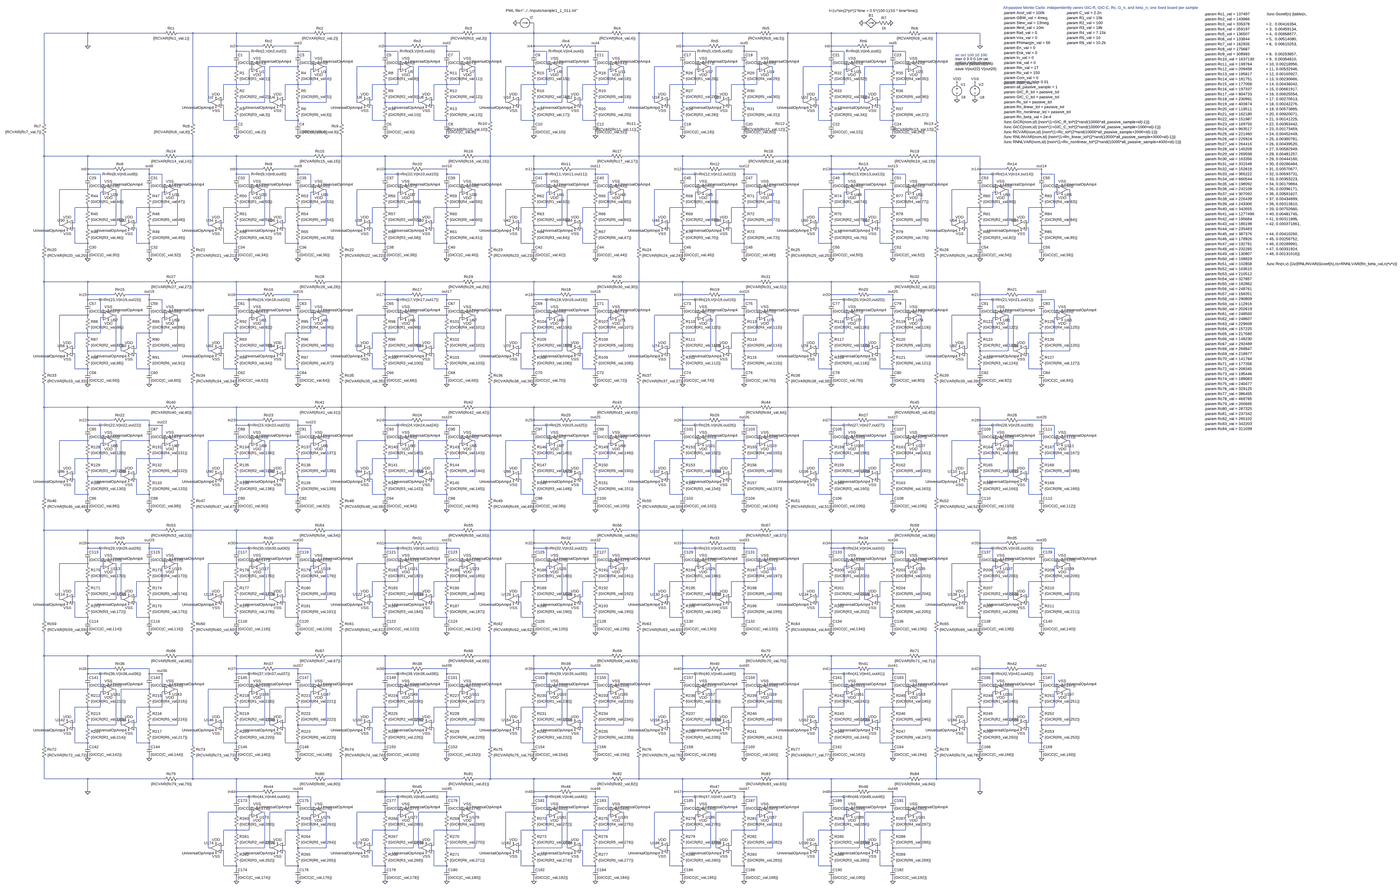
[diagram p0: schematic ALL.asc, whole sheet]
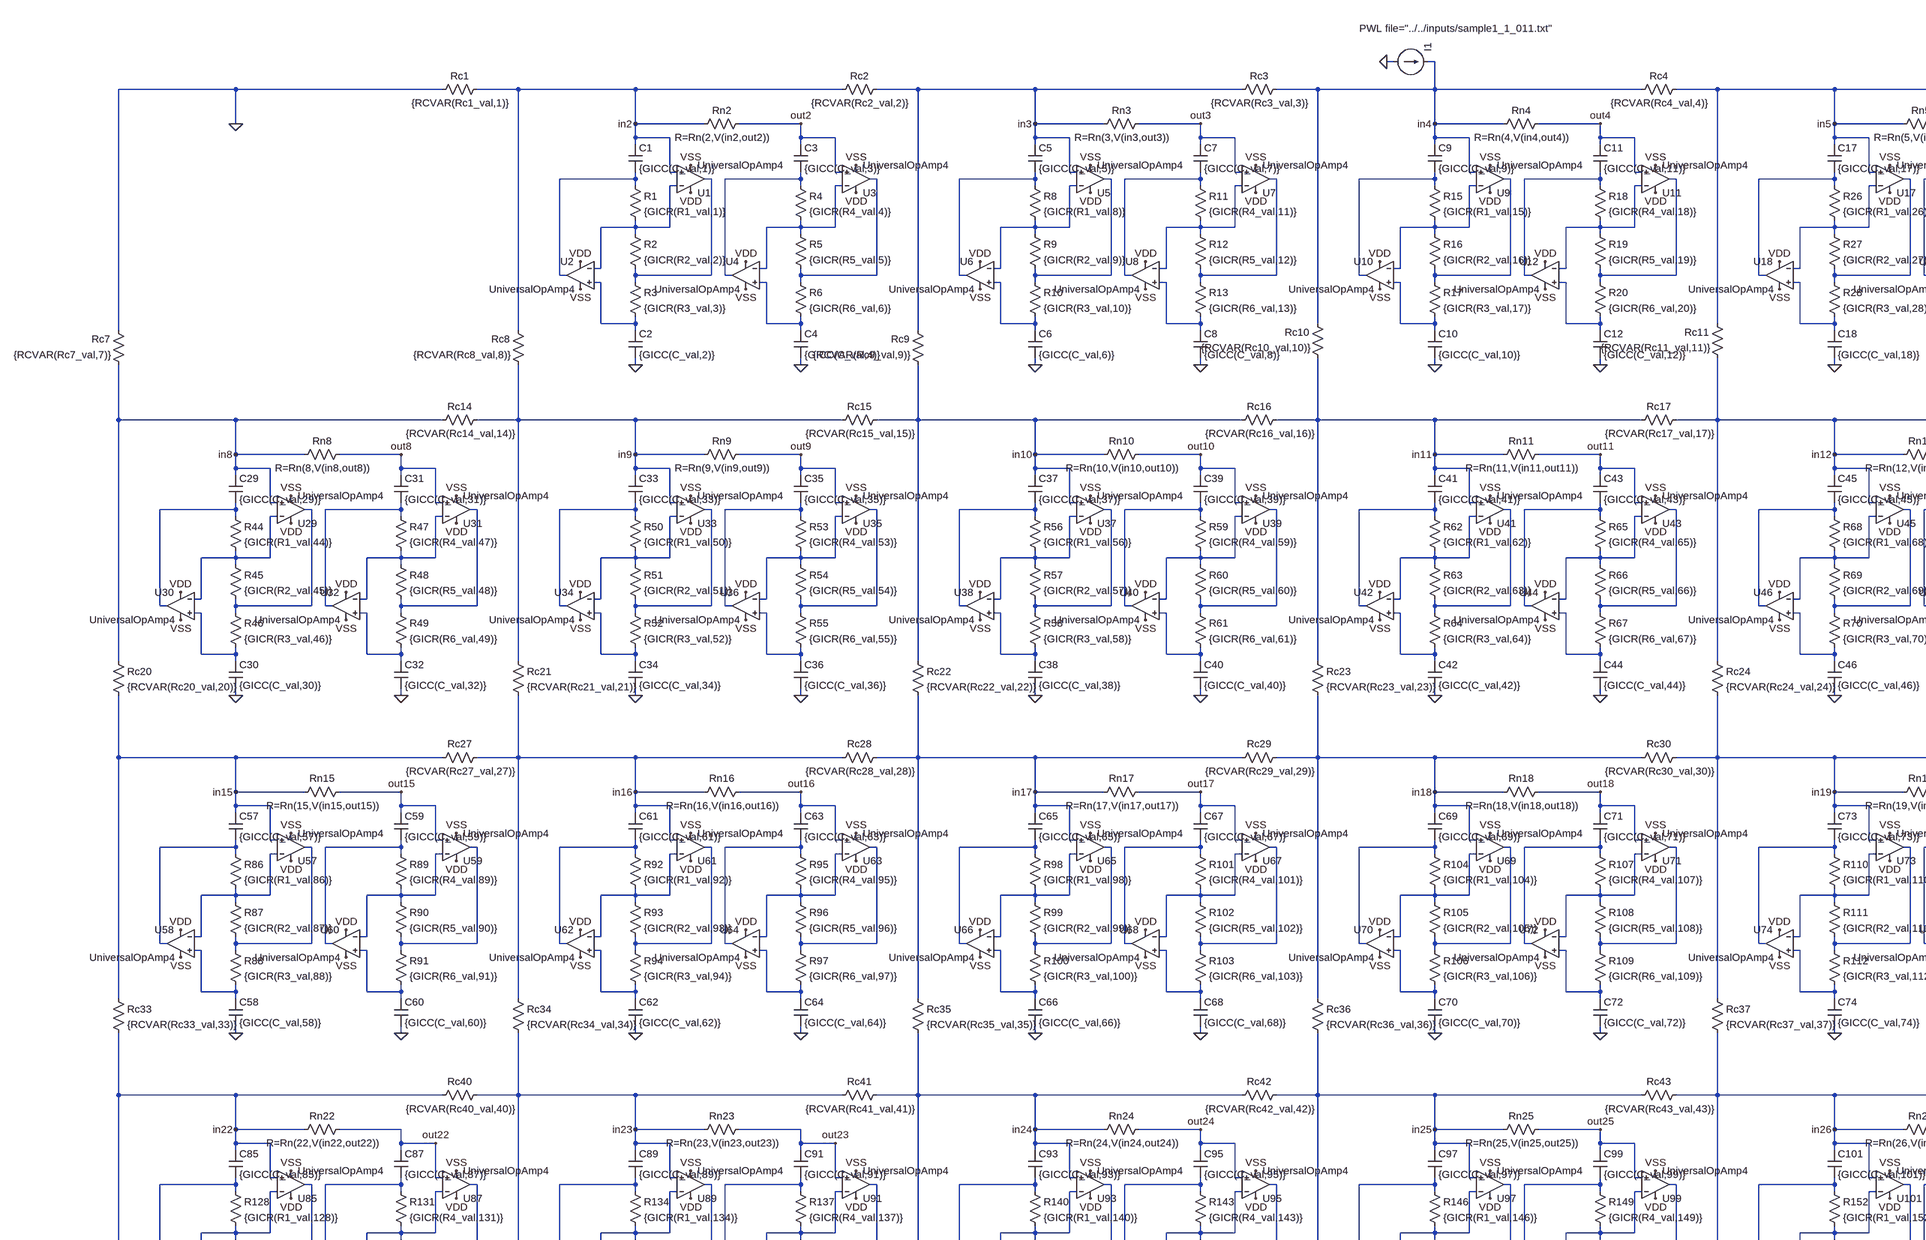
[diagram p1: schematic ALL.asc, part, row 1 of 2, column 1 of 2]
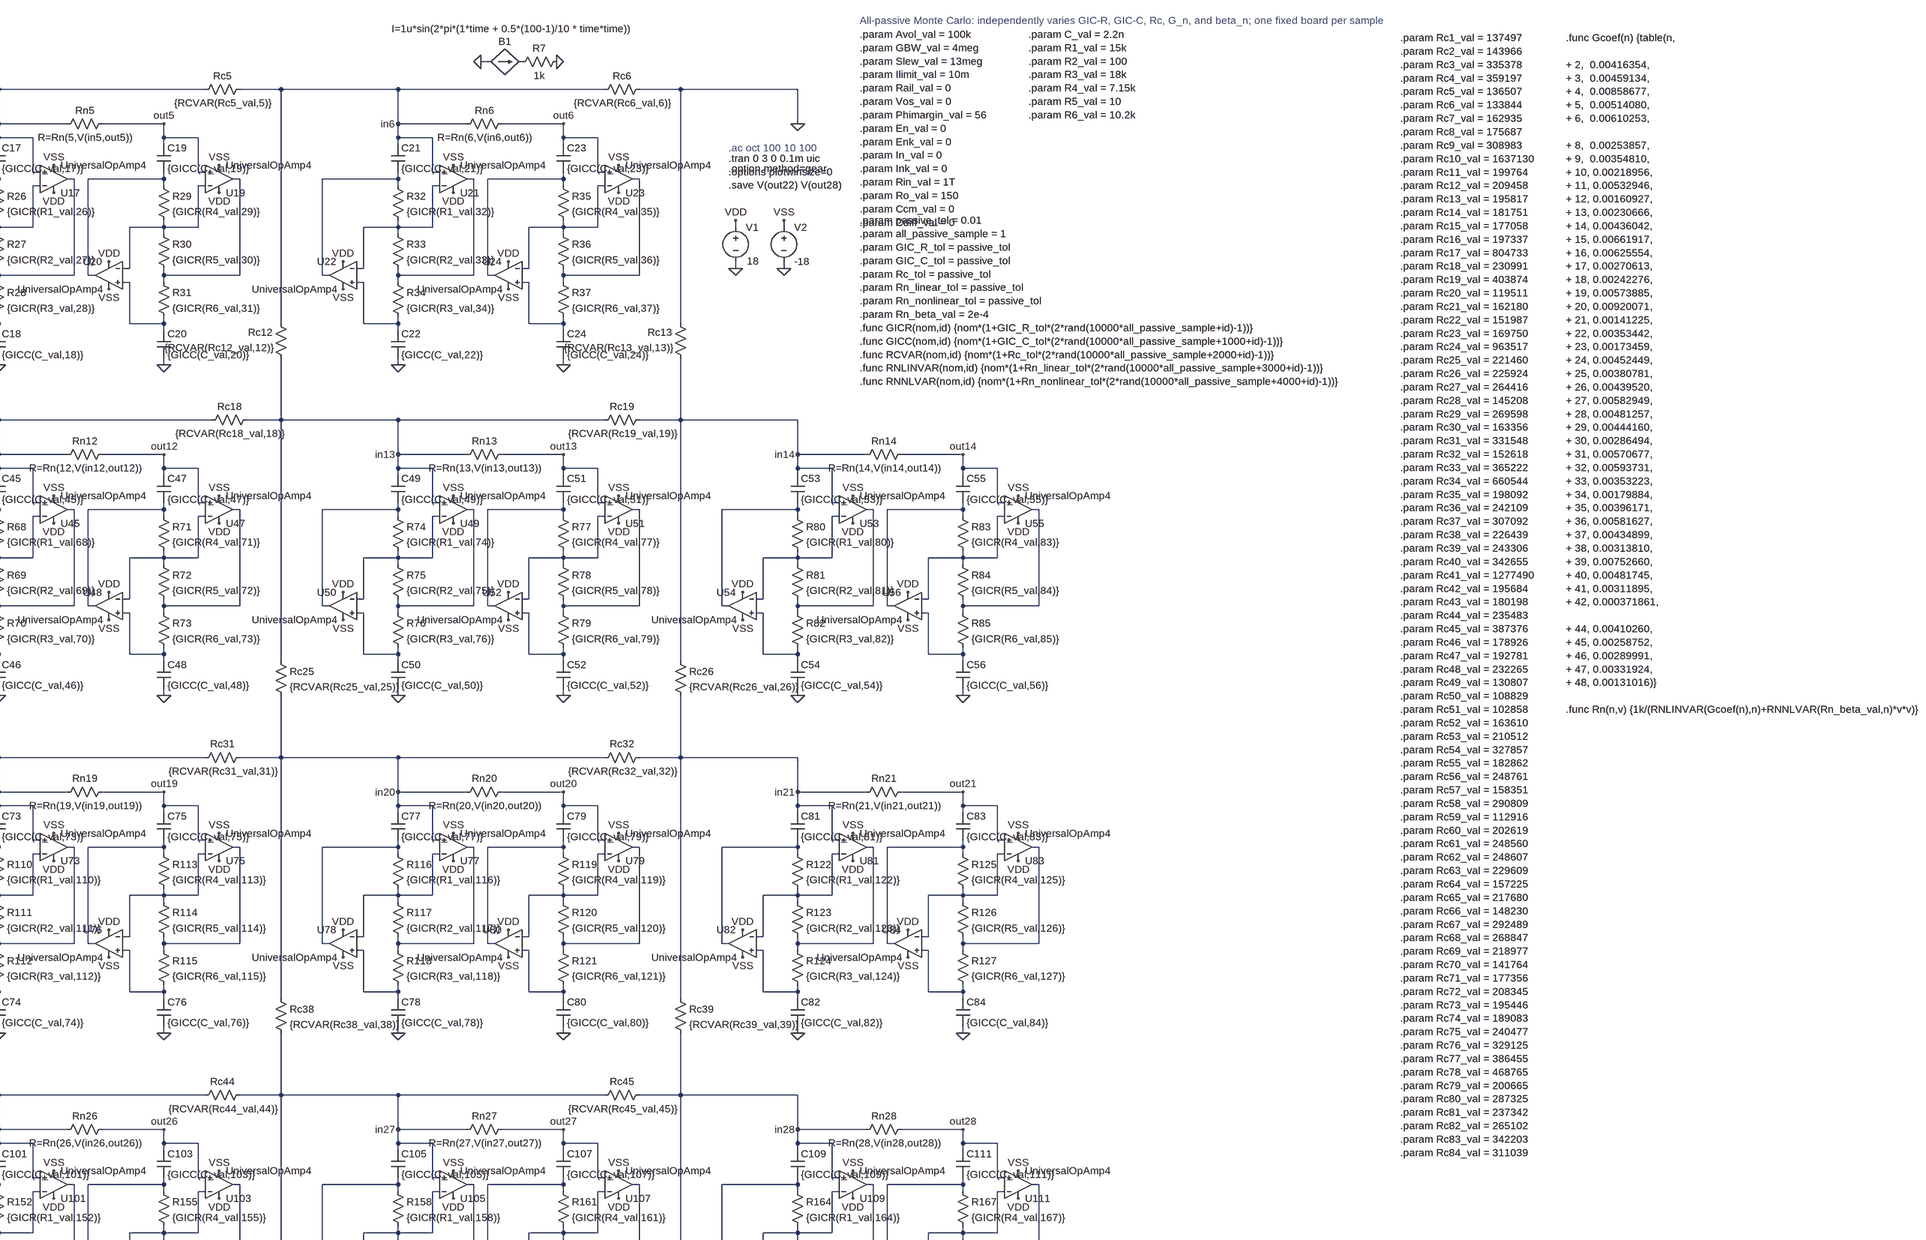
[diagram p2: schematic ALL.asc, part, row 1 of 2, column 2 of 2]
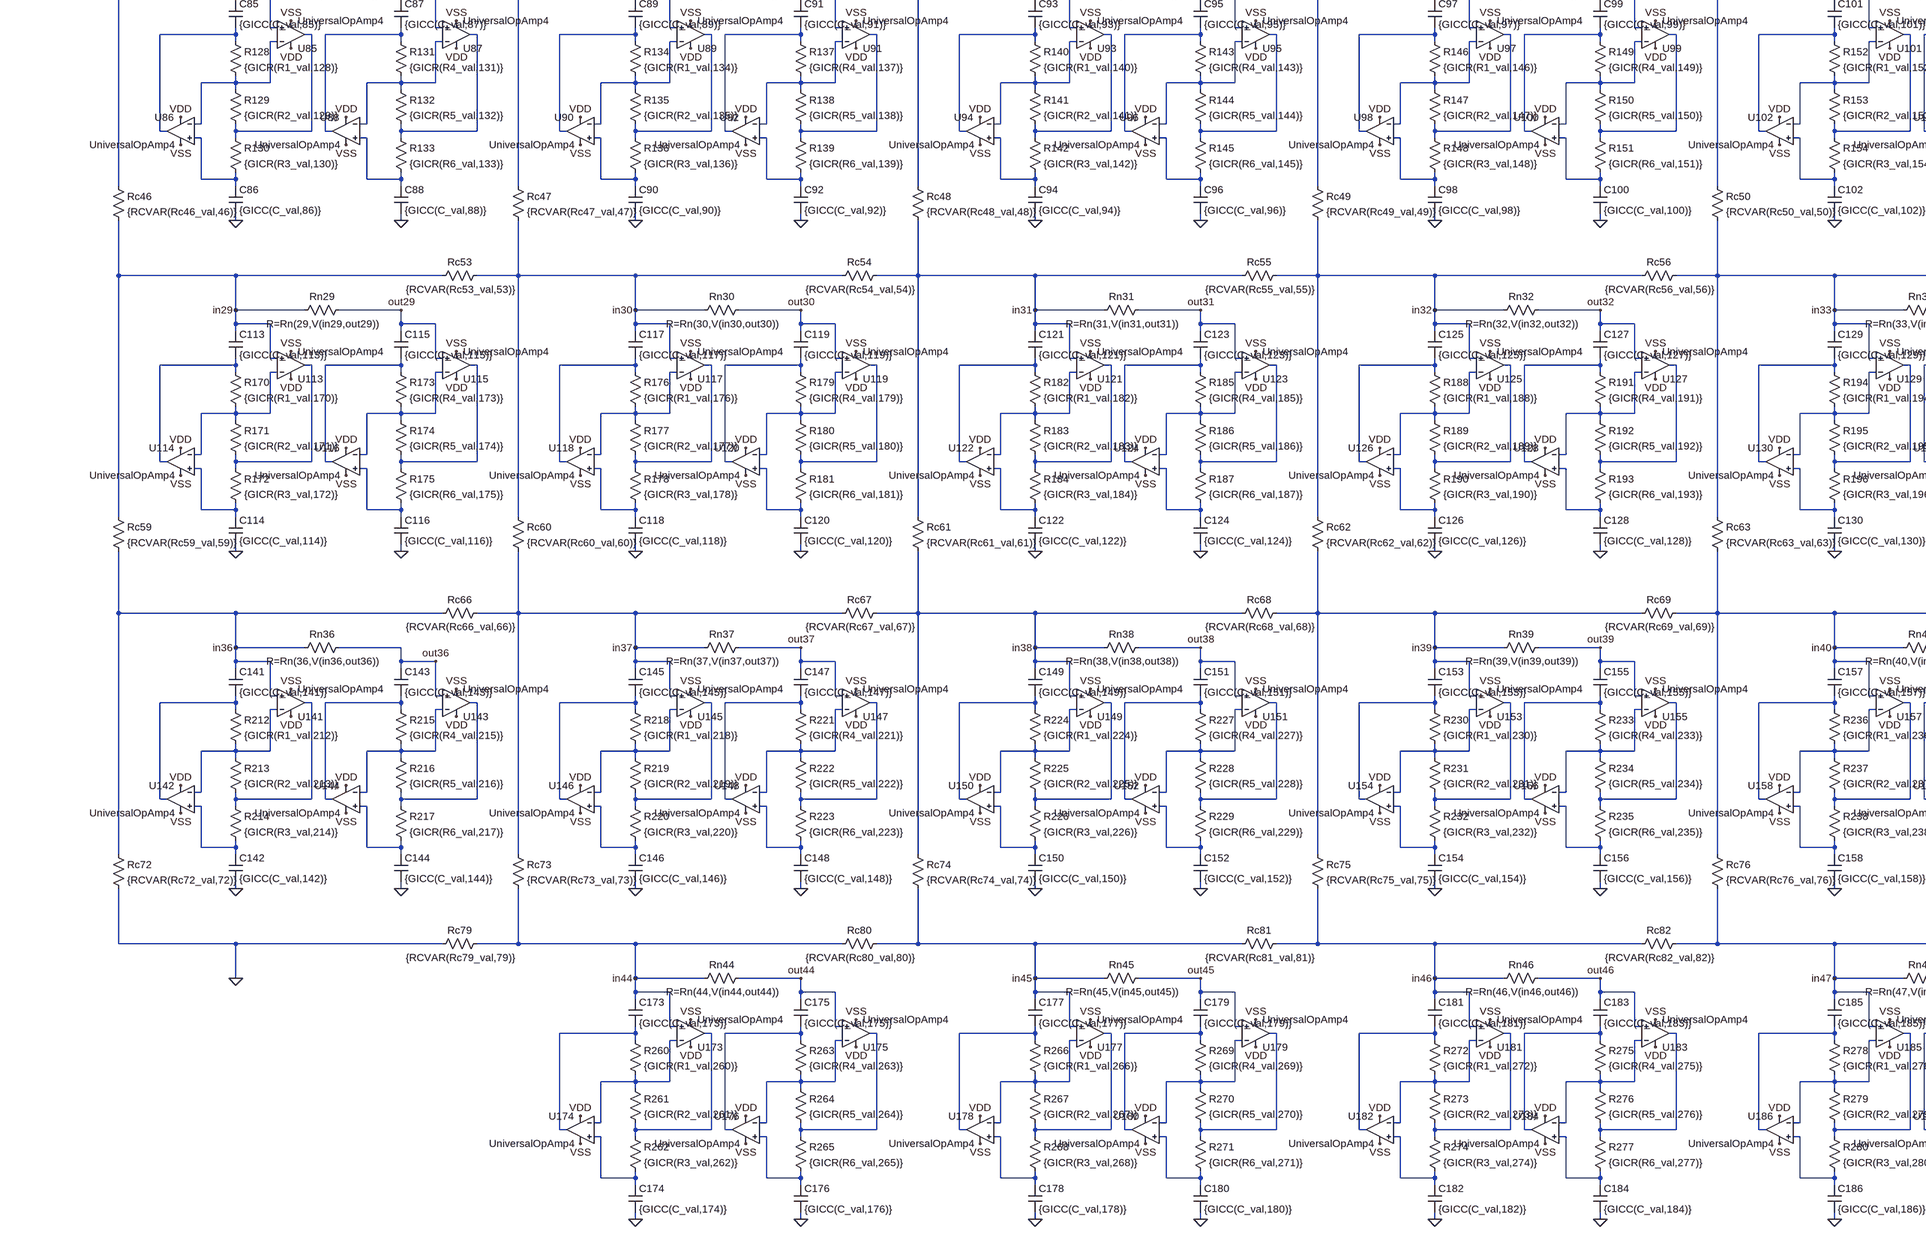
[diagram p3: schematic ALL.asc, part, row 2 of 2, column 1 of 2]
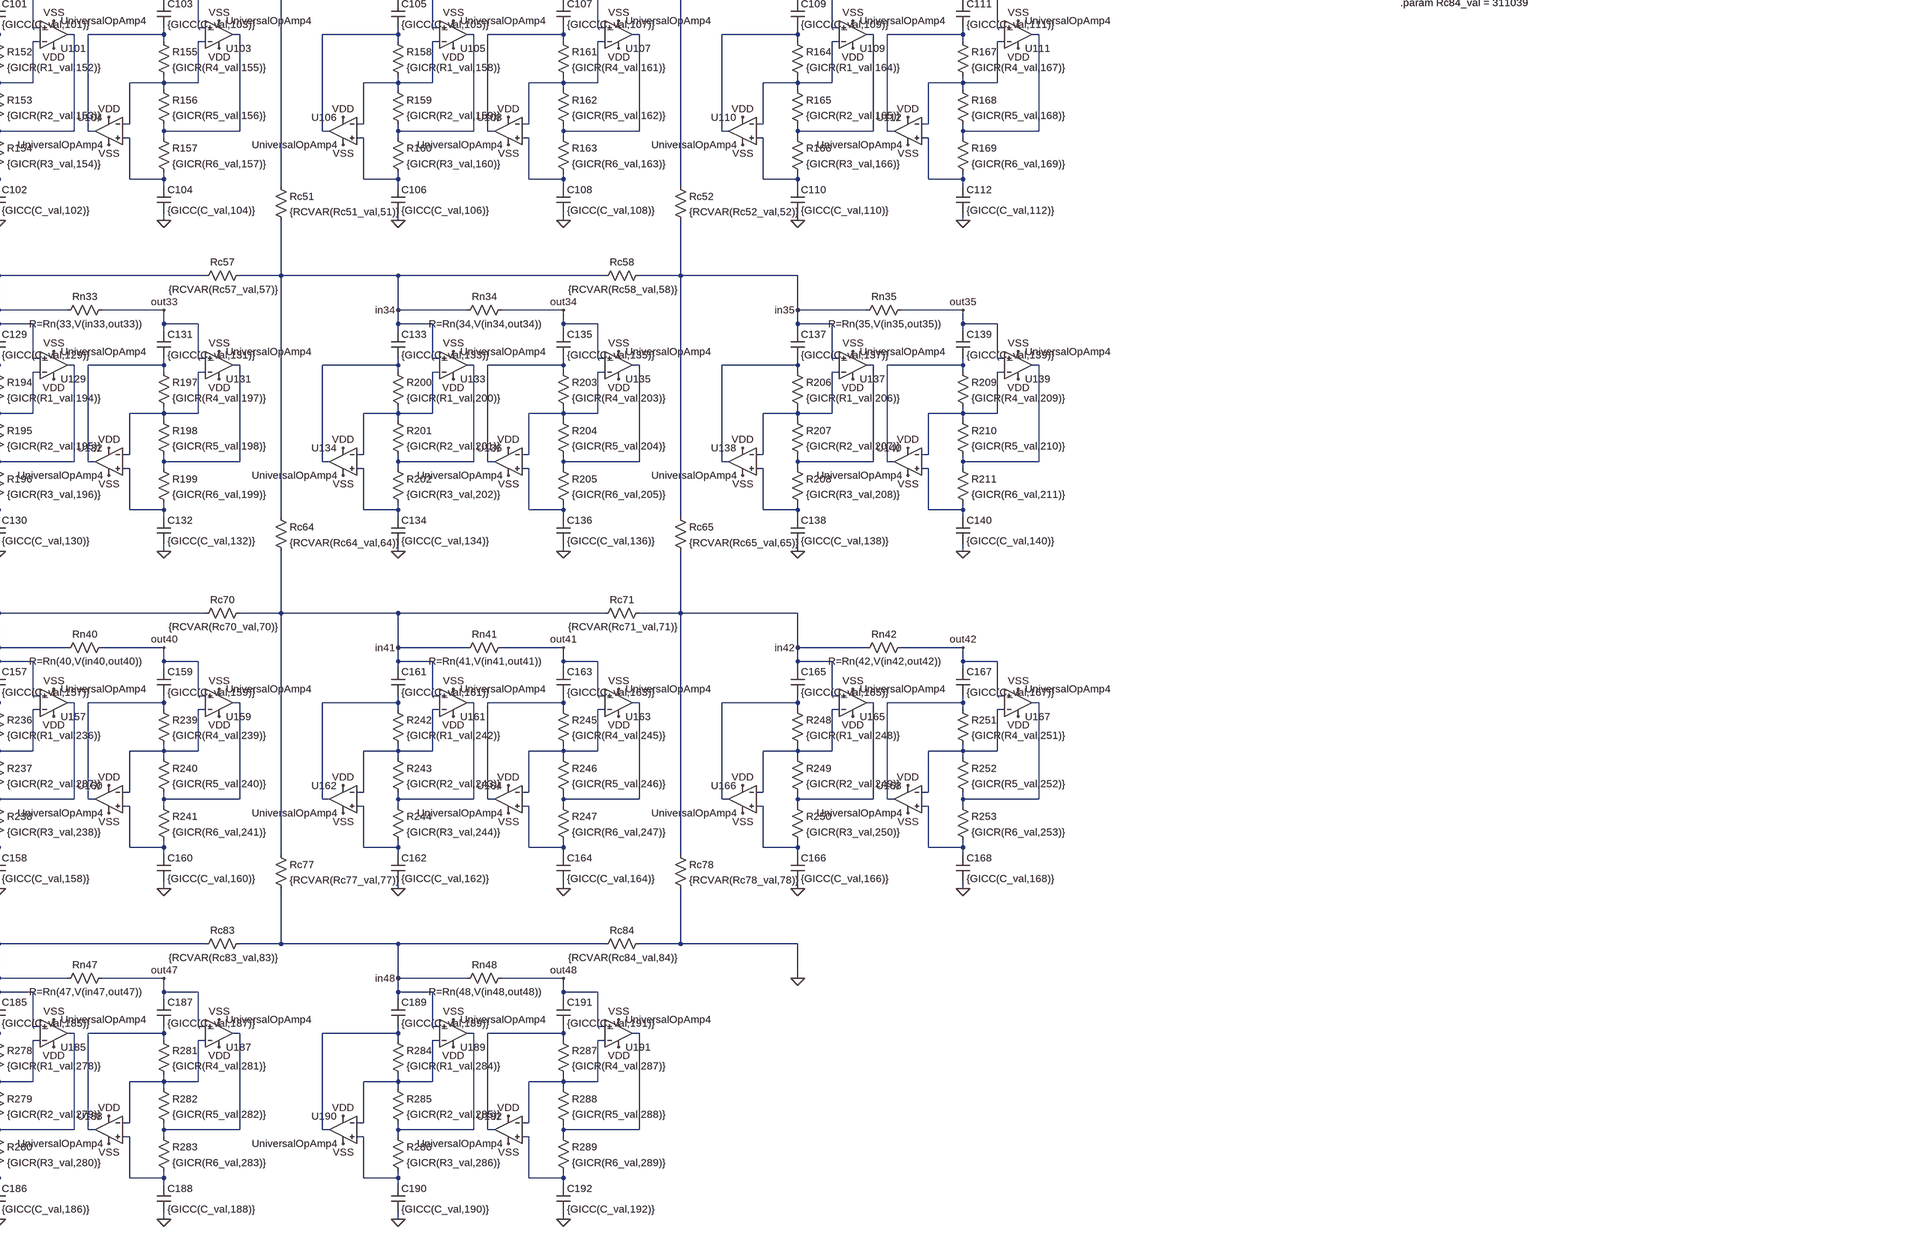
[diagram p4: schematic ALL.asc, part, row 2 of 2, column 2 of 2]
* ALL.asc
V1 VDD 0 18
V2 VSS 0 -18
C1 in2 N001 {GICC(C_val,1)}
R1 N001 N021 {GICR(R1_val,1)}
R2 N021 N002 {GICR(R2_val,2)}
R3 N002 N031 {GICR(R3_val,3)}
C2 N031 0 {GICC(C_val,2)}
C3 out2 N003 {GICC(C_val,3)}
R4 N003 N022 {GICR(R4_val,4)}
R5 N022 N004 {GICR(R5_val,5)}
R6 N004 N032 {GICR(R6_val,6)}
C4 N032 0 {GICC(C_val,4)}
Rn2 out2 in2 R=Rn(2,V(in2,out2))
C5 in3 N005 {GICC(C_val,5)}
R8 N005 N023 {GICR(R1_val,8)}
R9 N023 N006 {GICR(R2_val,9)}
R10 N006 N033 {GICR(R3_val,10)}
C6 N033 0 {GICC(C_val,6)}
C7 out3 N007 {GICC(C_val,7)}
R11 N007 N024 {GICR(R4_val,11)}
R12 N024 N008 {GICR(R5_val,12)}
R13 N008 N034 {GICR(R6_val,13)}
C8 N034 0 {GICC(C_val,8)}
Rn3 out3 in3 R=Rn(3,V(in3,out3))
C9 in4 N009 {GICC(C_val,9)}
R15 N009 N025 {GICR(R1_val,15)}
R16 N025 N010 {GICR(R2_val,16)}
R17 N010 N035 {GICR(R3_val,17)}
C10 N035 0 {GICC(C_val,10)}
C11 out4 N011 {GICC(C_val,11)}
R18 N011 N026 {GICR(R4_val,18)}
R19 N026 N012 {GICR(R5_val,19)}
R20 N012 N036 {GICR(R6_val,20)}
C12 N036 0 {GICC(C_val,12)}
Rn4 out4 in4 R=Rn(4,V(in4,out4))
Rc2 in3 in2 {RCVAR(Rc2_val,2)}
Rc3 in4 in3 {RCVAR(Rc3_val,3)}
Rc8 in9 in2 {RCVAR(Rc8_val,8)}
Rc9 in10 in3 {RCVAR(Rc9_val,9)}
Rc10 in11 in4 {RCVAR(Rc10_val,10)}
Rc14 in8 in9 {RCVAR(Rc14_val,14)}
Rc15 in9 in10 {RCVAR(Rc15_val,15)}
Rc16 in10 in11 {RCVAR(Rc16_val,16)}
Rc17 in11 in12 {RCVAR(Rc17_val,17)}
Rc20 in8 in15 {RCVAR(Rc20_val,20)}
Rc21 in9 in16 {RCVAR(Rc21_val,21)}
Rc22 in10 in17 {RCVAR(Rc22_val,22)}
Rc23 in11 in18 {RCVAR(Rc23_val,23)}
Rc24 in12 in19 {RCVAR(Rc24_val,24)}
Rc27 in16 in15 {RCVAR(Rc27_val,27)}
Rc28 in17 in16 {RCVAR(Rc28_val,28)}
Rc29 in18 in17 {RCVAR(Rc29_val,29)}
Rc30 in19 in18 {RCVAR(Rc30_val,30)}
Rc33 in15 in22 {RCVAR(Rc33_val,33)}
Rc34 in16 in23 {RCVAR(Rc34_val,34)}
Rc35 in17 in24 {RCVAR(Rc35_val,35)}
Rc36 in18 in25 {RCVAR(Rc36_val,36)}
Rc37 in19 in26 {RCVAR(Rc37_val,37)}
Rc40 in23 in22 {RCVAR(Rc40_val,40)}
Rc41 in24 in23 {RCVAR(Rc41_val,41)}
Rc42 in25 in24 {RCVAR(Rc42_val,42)}
Rc43 in26 in25 {RCVAR(Rc43_val,43)}
Rc46 in22 in29 {RCVAR(Rc46_val,46)}
Rc47 in23 in30 {RCVAR(Rc47_val,47)}
Rc48 in24 in31 {RCVAR(Rc48_val,48)}
Rc49 in25 in32 {RCVAR(Rc49_val,49)}
Rc50 in26 in33 {RCVAR(Rc50_val,50)}
Rc1 in2 0 {RCVAR(Rc1_val,1)}
Rc7 in8 0 {RCVAR(Rc7_val,7)}
Rc11 in12 in5 {RCVAR(Rc11_val,11)}
Rc4 in4 in5 {RCVAR(Rc4_val,4)}
Rc53 in30 in29 {RCVAR(Rc53_val,53)}
Rc54 in31 in30 {RCVAR(Rc54_val,54)}
Rc55 in32 in31 {RCVAR(Rc55_val,55)}
Rc56 in33 in32 {RCVAR(Rc56_val,56)}
R7 0 P001 1k
B1 0 P001 I=1u*sin(2*pi*(1*time + 0.5*(100-1)/10 * time*time))
I1 0 in4 PWL file="../../inputs/sample1_1_011.txt"
* U1: UniversalOpAmp4 Avol={Avol_val} GBW={GBW_val} Slew={Slew_val} Ilimit={Ilimit_val} Rail={Rail_val} Vos={Vos_val} Phimargin={Phimargin_val} En={En_val} Enk={Enk_val} In={In_val} Ink={Ink_val} Rin={Rin_val} Ro={Ro_val} Ccm={Ccm_val} Cdiff={Cdiff_val} (symbol OpAmps\UniversalOpAmp4 not available, pins judged from their places): In+=in2 In-=N021 V+=VDD V-=VSS OUT=N002
* U2: UniversalOpAmp4 Avol={Avol_val} GBW={GBW_val} Slew={Slew_val} Ilimit={Ilimit_val} Rail={Rail_val} Vos={Vos_val} Phimargin={Phimargin_val} En={En_val} Enk={Enk_val} In={In_val} Ink={Ink_val} Rin={Rin_val} Ro={Ro_val} Ccm={Ccm_val} Cdiff={Cdiff_val} (symbol OpAmps\UniversalOpAmp4 not available, pins judged from their places): In+=N031 In-=N021 V+=VDD V-=VSS OUT=N001
* U3: UniversalOpAmp4 Avol={Avol_val} GBW={GBW_val} Slew={Slew_val} Ilimit={Ilimit_val} Rail={Rail_val} Vos={Vos_val} Phimargin={Phimargin_val} En={En_val} Enk={Enk_val} In={In_val} Ink={Ink_val} Rin={Rin_val} Ro={Ro_val} Ccm={Ccm_val} Cdiff={Cdiff_val} (symbol OpAmps\UniversalOpAmp4 not available, pins judged from their places): In+=out2 In-=N022 V+=VDD V-=VSS OUT=N004
* U4: UniversalOpAmp4 Avol={Avol_val} GBW={GBW_val} Slew={Slew_val} Ilimit={Ilimit_val} Rail={Rail_val} Vos={Vos_val} Phimargin={Phimargin_val} En={En_val} Enk={Enk_val} In={In_val} Ink={Ink_val} Rin={Rin_val} Ro={Ro_val} Ccm={Ccm_val} Cdiff={Cdiff_val} (symbol OpAmps\UniversalOpAmp4 not available, pins judged from their places): In+=N032 In-=N022 V+=VDD V-=VSS OUT=N003
* U5: UniversalOpAmp4 Avol={Avol_val} GBW={GBW_val} Slew={Slew_val} Ilimit={Ilimit_val} Rail={Rail_val} Vos={Vos_val} Phimargin={Phimargin_val} En={En_val} Enk={Enk_val} In={In_val} Ink={Ink_val} Rin={Rin_val} Ro={Ro_val} Ccm={Ccm_val} Cdiff={Cdiff_val} (symbol OpAmps\UniversalOpAmp4 not available, pins judged from their places): In+=in3 In-=N023 V+=VDD V-=VSS OUT=N006
* U6: UniversalOpAmp4 Avol={Avol_val} GBW={GBW_val} Slew={Slew_val} Ilimit={Ilimit_val} Rail={Rail_val} Vos={Vos_val} Phimargin={Phimargin_val} En={En_val} Enk={Enk_val} In={In_val} Ink={Ink_val} Rin={Rin_val} Ro={Ro_val} Ccm={Ccm_val} Cdiff={Cdiff_val} (symbol OpAmps\UniversalOpAmp4 not available, pins judged from their places): In+=N033 In-=N023 V+=VDD V-=VSS OUT=N005
* U7: UniversalOpAmp4 Avol={Avol_val} GBW={GBW_val} Slew={Slew_val} Ilimit={Ilimit_val} Rail={Rail_val} Vos={Vos_val} Phimargin={Phimargin_val} En={En_val} Enk={Enk_val} In={In_val} Ink={Ink_val} Rin={Rin_val} Ro={Ro_val} Ccm={Ccm_val} Cdiff={Cdiff_val} (symbol OpAmps\UniversalOpAmp4 not available, pins judged from their places): In+=out3 In-=N024 V+=VDD V-=VSS OUT=N008
* U8: UniversalOpAmp4 Avol={Avol_val} GBW={GBW_val} Slew={Slew_val} Ilimit={Ilimit_val} Rail={Rail_val} Vos={Vos_val} Phimargin={Phimargin_val} En={En_val} Enk={Enk_val} In={In_val} Ink={Ink_val} Rin={Rin_val} Ro={Ro_val} Ccm={Ccm_val} Cdiff={Cdiff_val} (symbol OpAmps\UniversalOpAmp4 not available, pins judged from their places): In+=N034 In-=N024 V+=VDD V-=VSS OUT=N007
* U9: UniversalOpAmp4 Avol={Avol_val} GBW={GBW_val} Slew={Slew_val} Ilimit={Ilimit_val} Rail={Rail_val} Vos={Vos_val} Phimargin={Phimargin_val} En={En_val} Enk={Enk_val} In={In_val} Ink={Ink_val} Rin={Rin_val} Ro={Ro_val} Ccm={Ccm_val} Cdiff={Cdiff_val} (symbol OpAmps\UniversalOpAmp4 not available, pins judged from their places): In+=in4 In-=N025 V+=VDD V-=VSS OUT=N010
* U10: UniversalOpAmp4 Avol={Avol_val} GBW={GBW_val} Slew={Slew_val} Ilimit={Ilimit_val} Rail={Rail_val} Vos={Vos_val} Phimargin={Phimargin_val} En={En_val} Enk={Enk_val} In={In_val} Ink={Ink_val} Rin={Rin_val} Ro={Ro_val} Ccm={Ccm_val} Cdiff={Cdiff_val} (symbol OpAmps\UniversalOpAmp4 not available, pins judged from their places): In+=N035 In-=N025 V+=VDD V-=VSS OUT=N009
* U11: UniversalOpAmp4 Avol={Avol_val} GBW={GBW_val} Slew={Slew_val} Ilimit={Ilimit_val} Rail={Rail_val} Vos={Vos_val} Phimargin={Phimargin_val} En={En_val} Enk={Enk_val} In={In_val} Ink={Ink_val} Rin={Rin_val} Ro={Ro_val} Ccm={Ccm_val} Cdiff={Cdiff_val} (symbol OpAmps\UniversalOpAmp4 not available, pins judged from their places): In+=out4 In-=N026 V+=VDD V-=VSS OUT=N012
* U12: UniversalOpAmp4 Avol={Avol_val} GBW={GBW_val} Slew={Slew_val} Ilimit={Ilimit_val} Rail={Rail_val} Vos={Vos_val} Phimargin={Phimargin_val} En={En_val} Enk={Enk_val} In={In_val} Ink={Ink_val} Rin={Rin_val} Ro={Ro_val} Ccm={Ccm_val} Cdiff={Cdiff_val} (symbol OpAmps\UniversalOpAmp4 not available, pins judged from their places): In+=N036 In-=N026 V+=VDD V-=VSS OUT=N011
Rc12 in13 in6 {RCVAR(Rc12_val,12)}
Rc19 in13 in14 {RCVAR(Rc19_val,19)}
Rc25 in13 in20 {RCVAR(Rc25_val,25)}
Rc26 in14 in21 {RCVAR(Rc26_val,26)}
Rc32 in21 in20 {RCVAR(Rc32_val,32)}
Rc38 in20 in27 {RCVAR(Rc38_val,38)}
Rc39 in21 in28 {RCVAR(Rc39_val,39)}
Rc45 in28 in27 {RCVAR(Rc45_val,45)}
Rc51 in27 in34 {RCVAR(Rc51_val,51)}
Rc52 in28 in35 {RCVAR(Rc52_val,52)}
Rc13 in14 0 {RCVAR(Rc13_val,13)}
Rc6 in6 0 {RCVAR(Rc6_val,6)}
Rc58 in35 in34 {RCVAR(Rc58_val,58)}
Rc5 in5 in6 {RCVAR(Rc5_val,5)}
Rc18 in12 in13 {RCVAR(Rc18_val,18)}
Rc31 in19 in20 {RCVAR(Rc31_val,31)}
Rc44 in26 in27 {RCVAR(Rc44_val,44)}
Rc57 in33 in34 {RCVAR(Rc57_val,57)}
Rc59 in29 in36 {RCVAR(Rc59_val,59)}
Rc60 in30 in37 {RCVAR(Rc60_val,60)}
Rc61 in31 in38 {RCVAR(Rc61_val,61)}
Rc62 in32 in39 {RCVAR(Rc62_val,62)}
Rc63 in33 in40 {RCVAR(Rc63_val,63)}
Rc66 in37 in36 {RCVAR(Rc66_val,66)}
Rc67 in38 in37 {RCVAR(Rc67_val,67)}
Rc68 in39 in38 {RCVAR(Rc68_val,68)}
Rc69 in40 in39 {RCVAR(Rc69_val,69)}
Rc72 in36 0 {RCVAR(Rc72_val,72)}
Rc73 in37 in44 {RCVAR(Rc73_val,73)}
Rc74 in38 in45 {RCVAR(Rc74_val,74)}
Rc75 in39 in46 {RCVAR(Rc75_val,75)}
Rc76 in40 in47 {RCVAR(Rc76_val,76)}
Rc79 in44 0 {RCVAR(Rc79_val,79)}
Rc80 in45 in44 {RCVAR(Rc80_val,80)}
Rc81 in46 in45 {RCVAR(Rc81_val,81)}
Rc82 in47 in46 {RCVAR(Rc82_val,82)}
Rc64 in34 in41 {RCVAR(Rc64_val,64)}
Rc65 in35 in42 {RCVAR(Rc65_val,65)}
Rc71 in42 in41 {RCVAR(Rc71_val,71)}
Rc77 in41 in48 {RCVAR(Rc77_val,77)}
Rc78 in42 0 {RCVAR(Rc78_val,78)}
Rc84 0 in48 {RCVAR(Rc84_val,84)}
Rc70 in40 in41 {RCVAR(Rc70_val,70)}
Rc83 in47 in48 {RCVAR(Rc83_val,83)}
C17 in5 N013 {GICC(C_val,17)}
R26 N013 N027 {GICR(R1_val,26)}
R27 N027 N014 {GICR(R2_val,27)}
R28 N014 N037 {GICR(R3_val,28)}
C18 N037 0 {GICC(C_val,18)}
C19 out5 N015 {GICC(C_val,19)}
R29 N015 N028 {GICR(R4_val,29)}
R30 N028 N016 {GICR(R5_val,30)}
R31 N016 N038 {GICR(R6_val,31)}
C20 N038 0 {GICC(C_val,20)}
Rn5 out5 in5 R=Rn(5,V(in5,out5))
* U17: UniversalOpAmp4 Avol={Avol_val} GBW={GBW_val} Slew={Slew_val} Ilimit={Ilimit_val} Rail={Rail_val} Vos={Vos_val} Phimargin={Phimargin_val} En={En_val} Enk={Enk_val} In={In_val} Ink={Ink_val} Rin={Rin_val} Ro={Ro_val} Ccm={Ccm_val} Cdiff={Cdiff_val} (symbol OpAmps\UniversalOpAmp4 not available, pins judged from their places): In+=in5 In-=N027 V+=VDD V-=VSS OUT=N014
* U18: UniversalOpAmp4 Avol={Avol_val} GBW={GBW_val} Slew={Slew_val} Ilimit={Ilimit_val} Rail={Rail_val} Vos={Vos_val} Phimargin={Phimargin_val} En={En_val} Enk={Enk_val} In={In_val} Ink={Ink_val} Rin={Rin_val} Ro={Ro_val} Ccm={Ccm_val} Cdiff={Cdiff_val} (symbol OpAmps\UniversalOpAmp4 not available, pins judged from their places): In+=N037 In-=N027 V+=VDD V-=VSS OUT=N013
* U19: UniversalOpAmp4 Avol={Avol_val} GBW={GBW_val} Slew={Slew_val} Ilimit={Ilimit_val} Rail={Rail_val} Vos={Vos_val} Phimargin={Phimargin_val} En={En_val} Enk={Enk_val} In={In_val} Ink={Ink_val} Rin={Rin_val} Ro={Ro_val} Ccm={Ccm_val} Cdiff={Cdiff_val} (symbol OpAmps\UniversalOpAmp4 not available, pins judged from their places): In+=out5 In-=N028 V+=VDD V-=VSS OUT=N016
* U20: UniversalOpAmp4 Avol={Avol_val} GBW={GBW_val} Slew={Slew_val} Ilimit={Ilimit_val} Rail={Rail_val} Vos={Vos_val} Phimargin={Phimargin_val} En={En_val} Enk={Enk_val} In={In_val} Ink={Ink_val} Rin={Rin_val} Ro={Ro_val} Ccm={Ccm_val} Cdiff={Cdiff_val} (symbol OpAmps\UniversalOpAmp4 not available, pins judged from their places): In+=N038 In-=N028 V+=VDD V-=VSS OUT=N015
C21 in6 N017 {GICC(C_val,21)}
R32 N017 N029 {GICR(R1_val,32)}
R33 N029 N018 {GICR(R2_val,33)}
R34 N018 N039 {GICR(R3_val,34)}
C22 N039 0 {GICC(C_val,22)}
C23 out6 N019 {GICC(C_val,23)}
R35 N019 N030 {GICR(R4_val,35)}
R36 N030 N020 {GICR(R5_val,36)}
R37 N020 N040 {GICR(R6_val,37)}
C24 N040 0 {GICC(C_val,24)}
Rn6 out6 in6 R=Rn(6,V(in6,out6))
* U21: UniversalOpAmp4 Avol={Avol_val} GBW={GBW_val} Slew={Slew_val} Ilimit={Ilimit_val} Rail={Rail_val} Vos={Vos_val} Phimargin={Phimargin_val} En={En_val} Enk={Enk_val} In={In_val} Ink={Ink_val} Rin={Rin_val} Ro={Ro_val} Ccm={Ccm_val} Cdiff={Cdiff_val} (symbol OpAmps\UniversalOpAmp4 not available, pins judged from their places): In+=in6 In-=N029 V+=VDD V-=VSS OUT=N018
* U22: UniversalOpAmp4 Avol={Avol_val} GBW={GBW_val} Slew={Slew_val} Ilimit={Ilimit_val} Rail={Rail_val} Vos={Vos_val} Phimargin={Phimargin_val} En={En_val} Enk={Enk_val} In={In_val} Ink={Ink_val} Rin={Rin_val} Ro={Ro_val} Ccm={Ccm_val} Cdiff={Cdiff_val} (symbol OpAmps\UniversalOpAmp4 not available, pins judged from their places): In+=N039 In-=N029 V+=VDD V-=VSS OUT=N017
* U23: UniversalOpAmp4 Avol={Avol_val} GBW={GBW_val} Slew={Slew_val} Ilimit={Ilimit_val} Rail={Rail_val} Vos={Vos_val} Phimargin={Phimargin_val} En={En_val} Enk={Enk_val} In={In_val} Ink={Ink_val} Rin={Rin_val} Ro={Ro_val} Ccm={Ccm_val} Cdiff={Cdiff_val} (symbol OpAmps\UniversalOpAmp4 not available, pins judged from their places): In+=out6 In-=N030 V+=VDD V-=VSS OUT=N020
* U24: UniversalOpAmp4 Avol={Avol_val} GBW={GBW_val} Slew={Slew_val} Ilimit={Ilimit_val} Rail={Rail_val} Vos={Vos_val} Phimargin={Phimargin_val} En={En_val} Enk={Enk_val} In={In_val} Ink={Ink_val} Rin={Rin_val} Ro={Ro_val} Ccm={Ccm_val} Cdiff={Cdiff_val} (symbol OpAmps\UniversalOpAmp4 not available, pins judged from their places): In+=N040 In-=N030 V+=VDD V-=VSS OUT=N019
C29 in8 N041 {GICC(C_val,29)}
R44 N041 N069 {GICR(R1_val,44)}
R45 N069 N042 {GICR(R2_val,45)}
R46 N042 N083 {GICR(R3_val,46)}
C30 N083 0 {GICC(C_val,30)}
C31 out8 N043 {GICC(C_val,31)}
R47 N043 N070 {GICR(R4_val,47)}
R48 N070 N044 {GICR(R5_val,48)}
R49 N044 N084 {GICR(R6_val,49)}
C32 N084 0 {GICC(C_val,32)}
Rn8 out8 in8 R=Rn(8,V(in8,out8))
* U29: UniversalOpAmp4 Avol={Avol_val} GBW={GBW_val} Slew={Slew_val} Ilimit={Ilimit_val} Rail={Rail_val} Vos={Vos_val} Phimargin={Phimargin_val} En={En_val} Enk={Enk_val} In={In_val} Ink={Ink_val} Rin={Rin_val} Ro={Ro_val} Ccm={Ccm_val} Cdiff={Cdiff_val} (symbol OpAmps\UniversalOpAmp4 not available, pins judged from their places): In+=in8 In-=N069 V+=VDD V-=VSS OUT=N042
* U30: UniversalOpAmp4 Avol={Avol_val} GBW={GBW_val} Slew={Slew_val} Ilimit={Ilimit_val} Rail={Rail_val} Vos={Vos_val} Phimargin={Phimargin_val} En={En_val} Enk={Enk_val} In={In_val} Ink={Ink_val} Rin={Rin_val} Ro={Ro_val} Ccm={Ccm_val} Cdiff={Cdiff_val} (symbol OpAmps\UniversalOpAmp4 not available, pins judged from their places): In+=N083 In-=N069 V+=VDD V-=VSS OUT=N041
* U31: UniversalOpAmp4 Avol={Avol_val} GBW={GBW_val} Slew={Slew_val} Ilimit={Ilimit_val} Rail={Rail_val} Vos={Vos_val} Phimargin={Phimargin_val} En={En_val} Enk={Enk_val} In={In_val} Ink={Ink_val} Rin={Rin_val} Ro={Ro_val} Ccm={Ccm_val} Cdiff={Cdiff_val} (symbol OpAmps\UniversalOpAmp4 not available, pins judged from their places): In+=out8 In-=N070 V+=VDD V-=VSS OUT=N044
* U32: UniversalOpAmp4 Avol={Avol_val} GBW={GBW_val} Slew={Slew_val} Ilimit={Ilimit_val} Rail={Rail_val} Vos={Vos_val} Phimargin={Phimargin_val} En={En_val} Enk={Enk_val} In={In_val} Ink={Ink_val} Rin={Rin_val} Ro={Ro_val} Ccm={Ccm_val} Cdiff={Cdiff_val} (symbol OpAmps\UniversalOpAmp4 not available, pins judged from their places): In+=N084 In-=N070 V+=VDD V-=VSS OUT=N043
C33 in9 N045 {GICC(C_val,33)}
R50 N045 N071 {GICR(R1_val,50)}
R51 N071 N046 {GICR(R2_val,51)}
R52 N046 N085 {GICR(R3_val,52)}
C34 N085 0 {GICC(C_val,34)}
C35 out9 N047 {GICC(C_val,35)}
R53 N047 N072 {GICR(R4_val,53)}
R54 N072 N048 {GICR(R5_val,54)}
R55 N048 N086 {GICR(R6_val,55)}
C36 N086 0 {GICC(C_val,36)}
Rn9 out9 in9 R=Rn(9,V(in9,out9))
* U33: UniversalOpAmp4 Avol={Avol_val} GBW={GBW_val} Slew={Slew_val} Ilimit={Ilimit_val} Rail={Rail_val} Vos={Vos_val} Phimargin={Phimargin_val} En={En_val} Enk={Enk_val} In={In_val} Ink={Ink_val} Rin={Rin_val} Ro={Ro_val} Ccm={Ccm_val} Cdiff={Cdiff_val} (symbol OpAmps\UniversalOpAmp4 not available, pins judged from their places): In+=in9 In-=N071 V+=VDD V-=VSS OUT=N046
* U34: UniversalOpAmp4 Avol={Avol_val} GBW={GBW_val} Slew={Slew_val} Ilimit={Ilimit_val} Rail={Rail_val} Vos={Vos_val} Phimargin={Phimargin_val} En={En_val} Enk={Enk_val} In={In_val} Ink={Ink_val} Rin={Rin_val} Ro={Ro_val} Ccm={Ccm_val} Cdiff={Cdiff_val} (symbol OpAmps\UniversalOpAmp4 not available, pins judged from their places): In+=N085 In-=N071 V+=VDD V-=VSS OUT=N045
* U35: UniversalOpAmp4 Avol={Avol_val} GBW={GBW_val} Slew={Slew_val} Ilimit={Ilimit_val} Rail={Rail_val} Vos={Vos_val} Phimargin={Phimargin_val} En={En_val} Enk={Enk_val} In={In_val} Ink={Ink_val} Rin={Rin_val} Ro={Ro_val} Ccm={Ccm_val} Cdiff={Cdiff_val} (symbol OpAmps\UniversalOpAmp4 not available, pins judged from their places): In+=out9 In-=N072 V+=VDD V-=VSS OUT=N048
* U36: UniversalOpAmp4 Avol={Avol_val} GBW={GBW_val} Slew={Slew_val} Ilimit={Ilimit_val} Rail={Rail_val} Vos={Vos_val} Phimargin={Phimargin_val} En={En_val} Enk={Enk_val} In={In_val} Ink={Ink_val} Rin={Rin_val} Ro={Ro_val} Ccm={Ccm_val} Cdiff={Cdiff_val} (symbol OpAmps\UniversalOpAmp4 not available, pins judged from their places): In+=N086 In-=N072 V+=VDD V-=VSS OUT=N047
C37 in10 N049 {GICC(C_val,37)}
R56 N049 N073 {GICR(R1_val,56)}
R57 N073 N050 {GICR(R2_val,57)}
R58 N050 N087 {GICR(R3_val,58)}
C38 N087 0 {GICC(C_val,38)}
C39 out10 N051 {GICC(C_val,39)}
R59 N051 N074 {GICR(R4_val,59)}
R60 N074 N052 {GICR(R5_val,60)}
R61 N052 N088 {GICR(R6_val,61)}
C40 N088 0 {GICC(C_val,40)}
Rn10 out10 in10 R=Rn(10,V(in10,out10))
* U37: UniversalOpAmp4 Avol={Avol_val} GBW={GBW_val} Slew={Slew_val} Ilimit={Ilimit_val} Rail={Rail_val} Vos={Vos_val} Phimargin={Phimargin_val} En={En_val} Enk={Enk_val} In={In_val} Ink={Ink_val} Rin={Rin_val} Ro={Ro_val} Ccm={Ccm_val} Cdiff={Cdiff_val} (symbol OpAmps\UniversalOpAmp4 not available, pins judged from their places): In+=in10 In-=N073 V+=VDD V-=VSS OUT=N050
* U38: UniversalOpAmp4 Avol={Avol_val} GBW={GBW_val} Slew={Slew_val} Ilimit={Ilimit_val} Rail={Rail_val} Vos={Vos_val} Phimargin={Phimargin_val} En={En_val} Enk={Enk_val} In={In_val} Ink={Ink_val} Rin={Rin_val} Ro={Ro_val} Ccm={Ccm_val} Cdiff={Cdiff_val} (symbol OpAmps\UniversalOpAmp4 not available, pins judged from their places): In+=N087 In-=N073 V+=VDD V-=VSS OUT=N049
* U39: UniversalOpAmp4 Avol={Avol_val} GBW={GBW_val} Slew={Slew_val} Ilimit={Ilimit_val} Rail={Rail_val} Vos={Vos_val} Phimargin={Phimargin_val} En={En_val} Enk={Enk_val} In={In_val} Ink={Ink_val} Rin={Rin_val} Ro={Ro_val} Ccm={Ccm_val} Cdiff={Cdiff_val} (symbol OpAmps\UniversalOpAmp4 not available, pins judged from their places): In+=out10 In-=N074 V+=VDD V-=VSS OUT=N052
* U40: UniversalOpAmp4 Avol={Avol_val} GBW={GBW_val} Slew={Slew_val} Ilimit={Ilimit_val} Rail={Rail_val} Vos={Vos_val} Phimargin={Phimargin_val} En={En_val} Enk={Enk_val} In={In_val} Ink={Ink_val} Rin={Rin_val} Ro={Ro_val} Ccm={Ccm_val} Cdiff={Cdiff_val} (symbol OpAmps\UniversalOpAmp4 not available, pins judged from their places): In+=N088 In-=N074 V+=VDD V-=VSS OUT=N051
C41 in11 N053 {GICC(C_val,41)}
R62 N053 N075 {GICR(R1_val,62)}
R63 N075 N054 {GICR(R2_val,63)}
R64 N054 N089 {GICR(R3_val,64)}
C42 N089 0 {GICC(C_val,42)}
C43 out11 N055 {GICC(C_val,43)}
R65 N055 N076 {GICR(R4_val,65)}
R66 N076 N056 {GICR(R5_val,66)}
R67 N056 N090 {GICR(R6_val,67)}
C44 N090 0 {GICC(C_val,44)}
Rn11 out11 in11 R=Rn(11,V(in11,out11))
* U41: UniversalOpAmp4 Avol={Avol_val} GBW={GBW_val} Slew={Slew_val} Ilimit={Ilimit_val} Rail={Rail_val} Vos={Vos_val} Phimargin={Phimargin_val} En={En_val} Enk={Enk_val} In={In_val} Ink={Ink_val} Rin={Rin_val} Ro={Ro_val} Ccm={Ccm_val} Cdiff={Cdiff_val} (symbol OpAmps\UniversalOpAmp4 not available, pins judged from their places): In+=in11 In-=N075 V+=VDD V-=VSS OUT=N054
* U42: UniversalOpAmp4 Avol={Avol_val} GBW={GBW_val} Slew={Slew_val} Ilimit={Ilimit_val} Rail={Rail_val} Vos={Vos_val} Phimargin={Phimargin_val} En={En_val} Enk={Enk_val} In={In_val} Ink={Ink_val} Rin={Rin_val} Ro={Ro_val} Ccm={Ccm_val} Cdiff={Cdiff_val} (symbol OpAmps\UniversalOpAmp4 not available, pins judged from their places): In+=N089 In-=N075 V+=VDD V-=VSS OUT=N053
* U43: UniversalOpAmp4 Avol={Avol_val} GBW={GBW_val} Slew={Slew_val} Ilimit={Ilimit_val} Rail={Rail_val} Vos={Vos_val} Phimargin={Phimargin_val} En={En_val} Enk={Enk_val} In={In_val} Ink={Ink_val} Rin={Rin_val} Ro={Ro_val} Ccm={Ccm_val} Cdiff={Cdiff_val} (symbol OpAmps\UniversalOpAmp4 not available, pins judged from their places): In+=out11 In-=N076 V+=VDD V-=VSS OUT=N056
* U44: UniversalOpAmp4 Avol={Avol_val} GBW={GBW_val} Slew={Slew_val} Ilimit={Ilimit_val} Rail={Rail_val} Vos={Vos_val} Phimargin={Phimargin_val} En={En_val} Enk={Enk_val} In={In_val} Ink={Ink_val} Rin={Rin_val} Ro={Ro_val} Ccm={Ccm_val} Cdiff={Cdiff_val} (symbol OpAmps\UniversalOpAmp4 not available, pins judged from their places): In+=N090 In-=N076 V+=VDD V-=VSS OUT=N055
C45 in12 N057 {GICC(C_val,45)}
R68 N057 N077 {GICR(R1_val,68)}
R69 N077 N058 {GICR(R2_val,69)}
R70 N058 N091 {GICR(R3_val,70)}
C46 N091 0 {GICC(C_val,46)}
C47 out12 N059 {GICC(C_val,47)}
R71 N059 N078 {GICR(R4_val,71)}
R72 N078 N060 {GICR(R5_val,72)}
R73 N060 N092 {GICR(R6_val,73)}
C48 N092 0 {GICC(C_val,48)}
Rn12 out12 in12 R=Rn(12,V(in12,out12))
* U45: UniversalOpAmp4 Avol={Avol_val} GBW={GBW_val} Slew={Slew_val} Ilimit={Ilimit_val} Rail={Rail_val} Vos={Vos_val} Phimargin={Phimargin_val} En={En_val} Enk={Enk_val} In={In_val} Ink={Ink_val} Rin={Rin_val} Ro={Ro_val} Ccm={Ccm_val} Cdiff={Cdiff_val} (symbol OpAmps\UniversalOpAmp4 not available, pins judged from their places): In+=in12 In-=N077 V+=VDD V-=VSS OUT=N058
* U46: UniversalOpAmp4 Avol={Avol_val} GBW={GBW_val} Slew={Slew_val} Ilimit={Ilimit_val} Rail={Rail_val} Vos={Vos_val} Phimargin={Phimargin_val} En={En_val} Enk={Enk_val} In={In_val} Ink={Ink_val} Rin={Rin_val} Ro={Ro_val} Ccm={Ccm_val} Cdiff={Cdiff_val} (symbol OpAmps\UniversalOpAmp4 not available, pins judged from their places): In+=N091 In-=N077 V+=VDD V-=VSS OUT=N057
* U47: UniversalOpAmp4 Avol={Avol_val} GBW={GBW_val} Slew={Slew_val} Ilimit={Ilimit_val} Rail={Rail_val} Vos={Vos_val} Phimargin={Phimargin_val} En={En_val} Enk={Enk_val} In={In_val} Ink={Ink_val} Rin={Rin_val} Ro={Ro_val} Ccm={Ccm_val} Cdiff={Cdiff_val} (symbol OpAmps\UniversalOpAmp4 not available, pins judged from their places): In+=out12 In-=N078 V+=VDD V-=VSS OUT=N060
* U48: UniversalOpAmp4 Avol={Avol_val} GBW={GBW_val} Slew={Slew_val} Ilimit={Ilimit_val} Rail={Rail_val} Vos={Vos_val} Phimargin={Phimargin_val} En={En_val} Enk={Enk_val} In={In_val} Ink={Ink_val} Rin={Rin_val} Ro={Ro_val} Ccm={Ccm_val} Cdiff={Cdiff_val} (symbol OpAmps\UniversalOpAmp4 not available, pins judged from their places): In+=N092 In-=N078 V+=VDD V-=VSS OUT=N059
C49 in13 N061 {GICC(C_val,49)}
R74 N061 N079 {GICR(R1_val,74)}
R75 N079 N062 {GICR(R2_val,75)}
R76 N062 N093 {GICR(R3_val,76)}
C50 N093 0 {GICC(C_val,50)}
C51 out13 N063 {GICC(C_val,51)}
R77 N063 N080 {GICR(R4_val,77)}
R78 N080 N064 {GICR(R5_val,78)}
R79 N064 N094 {GICR(R6_val,79)}
C52 N094 0 {GICC(C_val,52)}
Rn13 out13 in13 R=Rn(13,V(in13,out13))
* U49: UniversalOpAmp4 Avol={Avol_val} GBW={GBW_val} Slew={Slew_val} Ilimit={Ilimit_val} Rail={Rail_val} Vos={Vos_val} Phimargin={Phimargin_val} En={En_val} Enk={Enk_val} In={In_val} Ink={Ink_val} Rin={Rin_val} Ro={Ro_val} Ccm={Ccm_val} Cdiff={Cdiff_val} (symbol OpAmps\UniversalOpAmp4 not available, pins judged from their places): In+=in13 In-=N079 V+=VDD V-=VSS OUT=N062
* U50: UniversalOpAmp4 Avol={Avol_val} GBW={GBW_val} Slew={Slew_val} Ilimit={Ilimit_val} Rail={Rail_val} Vos={Vos_val} Phimargin={Phimargin_val} En={En_val} Enk={Enk_val} In={In_val} Ink={Ink_val} Rin={Rin_val} Ro={Ro_val} Ccm={Ccm_val} Cdiff={Cdiff_val} (symbol OpAmps\UniversalOpAmp4 not available, pins judged from their places): In+=N093 In-=N079 V+=VDD V-=VSS OUT=N061
* U51: UniversalOpAmp4 Avol={Avol_val} GBW={GBW_val} Slew={Slew_val} Ilimit={Ilimit_val} Rail={Rail_val} Vos={Vos_val} Phimargin={Phimargin_val} En={En_val} Enk={Enk_val} In={In_val} Ink={Ink_val} Rin={Rin_val} Ro={Ro_val} Ccm={Ccm_val} Cdiff={Cdiff_val} (symbol OpAmps\UniversalOpAmp4 not available, pins judged from their places): In+=out13 In-=N080 V+=VDD V-=VSS OUT=N064
* U52: UniversalOpAmp4 Avol={Avol_val} GBW={GBW_val} Slew={Slew_val} Ilimit={Ilimit_val} Rail={Rail_val} Vos={Vos_val} Phimargin={Phimargin_val} En={En_val} Enk={Enk_val} In={In_val} Ink={Ink_val} Rin={Rin_val} Ro={Ro_val} Ccm={Ccm_val} Cdiff={Cdiff_val} (symbol OpAmps\UniversalOpAmp4 not available, pins judged from their places): In+=N094 In-=N080 V+=VDD V-=VSS OUT=N063
C53 in14 N065 {GICC(C_val,53)}
R80 N065 N081 {GICR(R1_val,80)}
R81 N081 N066 {GICR(R2_val,81)}
R82 N066 N095 {GICR(R3_val,82)}
C54 N095 0 {GICC(C_val,54)}
C55 out14 N067 {GICC(C_val,55)}
R83 N067 N082 {GICR(R4_val,83)}
R84 N082 N068 {GICR(R5_val,84)}
R85 N068 N096 {GICR(R6_val,85)}
C56 N096 0 {GICC(C_val,56)}
Rn14 out14 in14 R=Rn(14,V(in14,out14))
* U53: UniversalOpAmp4 Avol={Avol_val} GBW={GBW_val} Slew={Slew_val} Ilimit={Ilimit_val} Rail={Rail_val} Vos={Vos_val} Phimargin={Phimargin_val} En={En_val} Enk={Enk_val} In={In_val} Ink={Ink_val} Rin={Rin_val} Ro={Ro_val} Ccm={Ccm_val} Cdiff={Cdiff_val} (symbol OpAmps\UniversalOpAmp4 not available, pins judged from their places): In+=in14 In-=N081 V+=VDD V-=VSS OUT=N066
* U54: UniversalOpAmp4 Avol={Avol_val} GBW={GBW_val} Slew={Slew_val} Ilimit={Ilimit_val} Rail={Rail_val} Vos={Vos_val} Phimargin={Phimargin_val} En={En_val} Enk={Enk_val} In={In_val} Ink={Ink_val} Rin={Rin_val} Ro={Ro_val} Ccm={Ccm_val} Cdiff={Cdiff_val} (symbol OpAmps\UniversalOpAmp4 not available, pins judged from their places): In+=N095 In-=N081 V+=VDD V-=VSS OUT=N065
* U55: UniversalOpAmp4 Avol={Avol_val} GBW={GBW_val} Slew={Slew_val} Ilimit={Ilimit_val} Rail={Rail_val} Vos={Vos_val} Phimargin={Phimargin_val} En={En_val} Enk={Enk_val} In={In_val} Ink={Ink_val} Rin={Rin_val} Ro={Ro_val} Ccm={Ccm_val} Cdiff={Cdiff_val} (symbol OpAmps\UniversalOpAmp4 not available, pins judged from their places): In+=out14 In-=N082 V+=VDD V-=VSS OUT=N068
* U56: UniversalOpAmp4 Avol={Avol_val} GBW={GBW_val} Slew={Slew_val} Ilimit={Ilimit_val} Rail={Rail_val} Vos={Vos_val} Phimargin={Phimargin_val} En={En_val} Enk={Enk_val} In={In_val} Ink={Ink_val} Rin={Rin_val} Ro={Ro_val} Ccm={Ccm_val} Cdiff={Cdiff_val} (symbol OpAmps\UniversalOpAmp4 not available, pins judged from their places): In+=N096 In-=N082 V+=VDD V-=VSS OUT=N067
C57 in15 N097 {GICC(C_val,57)}
R86 N097 N125 {GICR(R1_val,86)}
R87 N125 N098 {GICR(R2_val,87)}
R88 N098 N139 {GICR(R3_val,88)}
C58 N139 0 {GICC(C_val,58)}
C59 out15 N099 {GICC(C_val,59)}
R89 N099 N126 {GICR(R4_val,89)}
R90 N126 N100 {GICR(R5_val,90)}
R91 N100 N140 {GICR(R6_val,91)}
C60 N140 0 {GICC(C_val,60)}
Rn15 out15 in15 R=Rn(15,V(in15,out15))
* U57: UniversalOpAmp4 Avol={Avol_val} GBW={GBW_val} Slew={Slew_val} Ilimit={Ilimit_val} Rail={Rail_val} Vos={Vos_val} Phimargin={Phimargin_val} En={En_val} Enk={Enk_val} In={In_val} Ink={Ink_val} Rin={Rin_val} Ro={Ro_val} Ccm={Ccm_val} Cdiff={Cdiff_val} (symbol OpAmps\UniversalOpAmp4 not available, pins judged from their places): In+=in15 In-=N125 V+=VDD V-=VSS OUT=N098
* U58: UniversalOpAmp4 Avol={Avol_val} GBW={GBW_val} Slew={Slew_val} Ilimit={Ilimit_val} Rail={Rail_val} Vos={Vos_val} Phimargin={Phimargin_val} En={En_val} Enk={Enk_val} In={In_val} Ink={Ink_val} Rin={Rin_val} Ro={Ro_val} Ccm={Ccm_val} Cdiff={Cdiff_val} (symbol OpAmps\UniversalOpAmp4 not available, pins judged from their places): In+=N139 In-=N125 V+=VDD V-=VSS OUT=N097
* U59: UniversalOpAmp4 Avol={Avol_val} GBW={GBW_val} Slew={Slew_val} Ilimit={Ilimit_val} Rail={Rail_val} Vos={Vos_val} Phimargin={Phimargin_val} En={En_val} Enk={Enk_val} In={In_val} Ink={Ink_val} Rin={Rin_val} Ro={Ro_val} Ccm={Ccm_val} Cdiff={Cdiff_val} (symbol OpAmps\UniversalOpAmp4 not available, pins judged from their places): In+=out15 In-=N126 V+=VDD V-=VSS OUT=N100
* U60: UniversalOpAmp4 Avol={Avol_val} GBW={GBW_val} Slew={Slew_val} Ilimit={Ilimit_val} Rail={Rail_val} Vos={Vos_val} Phimargin={Phimargin_val} En={En_val} Enk={Enk_val} In={In_val} Ink={Ink_val} Rin={Rin_val} Ro={Ro_val} Ccm={Ccm_val} Cdiff={Cdiff_val} (symbol OpAmps\UniversalOpAmp4 not available, pins judged from their places): In+=N140 In-=N126 V+=VDD V-=VSS OUT=N099
C61 in16 N101 {GICC(C_val,61)}
R92 N101 N127 {GICR(R1_val,92)}
R93 N127 N102 {GICR(R2_val,93)}
R94 N102 N141 {GICR(R3_val,94)}
C62 N141 0 {GICC(C_val,62)}
C63 out16 N103 {GICC(C_val,63)}
R95 N103 N128 {GICR(R4_val,95)}
R96 N128 N104 {GICR(R5_val,96)}
R97 N104 N142 {GICR(R6_val,97)}
C64 N142 0 {GICC(C_val,64)}
Rn16 out16 in16 R=Rn(16,V(in16,out16))
* U61: UniversalOpAmp4 Avol={Avol_val} GBW={GBW_val} Slew={Slew_val} Ilimit={Ilimit_val} Rail={Rail_val} Vos={Vos_val} Phimargin={Phimargin_val} En={En_val} Enk={Enk_val} In={In_val} Ink={Ink_val} Rin={Rin_val} Ro={Ro_val} Ccm={Ccm_val} Cdiff={Cdiff_val} (symbol OpAmps\UniversalOpAmp4 not available, pins judged from their places): In+=in16 In-=N127 V+=VDD V-=VSS OUT=N102
* U62: UniversalOpAmp4 Avol={Avol_val} GBW={GBW_val} Slew={Slew_val} Ilimit={Ilimit_val} Rail={Rail_val} Vos={Vos_val} Phimargin={Phimargin_val} En={En_val} Enk={Enk_val} In={In_val} Ink={Ink_val} Rin={Rin_val} Ro={Ro_val} Ccm={Ccm_val} Cdiff={Cdiff_val} (symbol OpAmps\UniversalOpAmp4 not available, pins judged from their places): In+=N141 In-=N127 V+=VDD V-=VSS OUT=N101
* U63: UniversalOpAmp4 Avol={Avol_val} GBW={GBW_val} Slew={Slew_val} Ilimit={Ilimit_val} Rail={Rail_val} Vos={Vos_val} Phimargin={Phimargin_val} En={En_val} Enk={Enk_val} In={In_val} Ink={Ink_val} Rin={Rin_val} Ro={Ro_val} Ccm={Ccm_val} Cdiff={Cdiff_val} (symbol OpAmps\UniversalOpAmp4 not available, pins judged from their places): In+=out16 In-=N128 V+=VDD V-=VSS OUT=N104
* U64: UniversalOpAmp4 Avol={Avol_val} GBW={GBW_val} Slew={Slew_val} Ilimit={Ilimit_val} Rail={Rail_val} Vos={Vos_val} Phimargin={Phimargin_val} En={En_val} Enk={Enk_val} In={In_val} Ink={Ink_val} Rin={Rin_val} Ro={Ro_val} Ccm={Ccm_val} Cdiff={Cdiff_val} (symbol OpAmps\UniversalOpAmp4 not available, pins judged from their places): In+=N142 In-=N128 V+=VDD V-=VSS OUT=N103
C65 in17 N105 {GICC(C_val,65)}
R98 N105 N129 {GICR(R1_val,98)}
R99 N129 N106 {GICR(R2_val,99)}
R100 N106 N143 {GICR(R3_val,100)}
C66 N143 0 {GICC(C_val,66)}
C67 out17 N107 {GICC(C_val,67)}
R101 N107 N130 {GICR(R4_val,101)}
R102 N130 N108 {GICR(R5_val,102)}
R103 N108 N144 {GICR(R6_val,103)}
C68 N144 0 {GICC(C_val,68)}
Rn17 out17 in17 R=Rn(17,V(in17,out17))
* U65: UniversalOpAmp4 Avol={Avol_val} GBW={GBW_val} Slew={Slew_val} Ilimit={Ilimit_val} Rail={Rail_val} Vos={Vos_val} Phimargin={Phimargin_val} En={En_val} Enk={Enk_val} In={In_val} Ink={Ink_val} Rin={Rin_val} Ro={Ro_val} Ccm={Ccm_val} Cdiff={Cdiff_val} (symbol OpAmps\UniversalOpAmp4 not available, pins judged from their places): In+=in17 In-=N129 V+=VDD V-=VSS OUT=N106
* U66: UniversalOpAmp4 Avol={Avol_val} GBW={GBW_val} Slew={Slew_val} Ilimit={Ilimit_val} Rail={Rail_val} Vos={Vos_val} Phimargin={Phimargin_val} En={En_val} Enk={Enk_val} In={In_val} Ink={Ink_val} Rin={Rin_val} Ro={Ro_val} Ccm={Ccm_val} Cdiff={Cdiff_val} (symbol OpAmps\UniversalOpAmp4 not available, pins judged from their places): In+=N143 In-=N129 V+=VDD V-=VSS OUT=N105
* U67: UniversalOpAmp4 Avol={Avol_val} GBW={GBW_val} Slew={Slew_val} Ilimit={Ilimit_val} Rail={Rail_val} Vos={Vos_val} Phimargin={Phimargin_val} En={En_val} Enk={Enk_val} In={In_val} Ink={Ink_val} Rin={Rin_val} Ro={Ro_val} Ccm={Ccm_val} Cdiff={Cdiff_val} (symbol OpAmps\UniversalOpAmp4 not available, pins judged from their places): In+=out17 In-=N130 V+=VDD V-=VSS OUT=N108
* U68: UniversalOpAmp4 Avol={Avol_val} GBW={GBW_val} Slew={Slew_val} Ilimit={Ilimit_val} Rail={Rail_val} Vos={Vos_val} Phimargin={Phimargin_val} En={En_val} Enk={Enk_val} In={In_val} Ink={Ink_val} Rin={Rin_val} Ro={Ro_val} Ccm={Ccm_val} Cdiff={Cdiff_val} (symbol OpAmps\UniversalOpAmp4 not available, pins judged from their places): In+=N144 In-=N130 V+=VDD V-=VSS OUT=N107
C69 in18 N109 {GICC(C_val,69)}
R104 N109 N131 {GICR(R1_val,104)}
R105 N131 N110 {GICR(R2_val,105)}
R106 N110 N145 {GICR(R3_val,106)}
C70 N145 0 {GICC(C_val,70)}
C71 out18 N111 {GICC(C_val,71)}
R107 N111 N132 {GICR(R4_val,107)}
R108 N132 N112 {GICR(R5_val,108)}
R109 N112 N146 {GICR(R6_val,109)}
C72 N146 0 {GICC(C_val,72)}
Rn18 out18 in18 R=Rn(18,V(in18,out18))
* U69: UniversalOpAmp4 Avol={Avol_val} GBW={GBW_val} Slew={Slew_val} Ilimit={Ilimit_val} Rail={Rail_val} Vos={Vos_val} Phimargin={Phimargin_val} En={En_val} Enk={Enk_val} In={In_val} Ink={Ink_val} Rin={Rin_val} Ro={Ro_val} Ccm={Ccm_val} Cdiff={Cdiff_val} (symbol OpAmps\UniversalOpAmp4 not available, pins judged from their places): In+=in18 In-=N131 V+=VDD V-=VSS OUT=N110
* U70: UniversalOpAmp4 Avol={Avol_val} GBW={GBW_val} Slew={Slew_val} Ilimit={Ilimit_val} Rail={Rail_val} Vos={Vos_val} Phimargin={Phimargin_val} En={En_val} Enk={Enk_val} In={In_val} Ink={Ink_val} Rin={Rin_val} Ro={Ro_val} Ccm={Ccm_val} Cdiff={Cdiff_val} (symbol OpAmps\UniversalOpAmp4 not available, pins judged from their places): In+=N145 In-=N131 V+=VDD V-=VSS OUT=N109
* U71: UniversalOpAmp4 Avol={Avol_val} GBW={GBW_val} Slew={Slew_val} Ilimit={Ilimit_val} Rail={Rail_val} Vos={Vos_val} Phimargin={Phimargin_val} En={En_val} Enk={Enk_val} In={In_val} Ink={Ink_val} Rin={Rin_val} Ro={Ro_val} Ccm={Ccm_val} Cdiff={Cdiff_val} (symbol OpAmps\UniversalOpAmp4 not available, pins judged from their places): In+=out18 In-=N132 V+=VDD V-=VSS OUT=N112
* U72: UniversalOpAmp4 Avol={Avol_val} GBW={GBW_val} Slew={Slew_val} Ilimit={Ilimit_val} Rail={Rail_val} Vos={Vos_val} Phimargin={Phimargin_val} En={En_val} Enk={Enk_val} In={In_val} Ink={Ink_val} Rin={Rin_val} Ro={Ro_val} Ccm={Ccm_val} Cdiff={Cdiff_val} (symbol OpAmps\UniversalOpAmp4 not available, pins judged from their places): In+=N146 In-=N132 V+=VDD V-=VSS OUT=N111
C73 in19 N113 {GICC(C_val,73)}
R110 N113 N133 {GICR(R1_val,110)}
R111 N133 N114 {GICR(R2_val,111)}
R112 N114 N147 {GICR(R3_val,112)}
C74 N147 0 {GICC(C_val,74)}
C75 out19 N115 {GICC(C_val,75)}
R113 N115 N134 {GICR(R4_val,113)}
R114 N134 N116 {GICR(R5_val,114)}
R115 N116 N148 {GICR(R6_val,115)}
C76 N148 0 {GICC(C_val,76)}
Rn19 out19 in19 R=Rn(19,V(in19,out19))
* U73: UniversalOpAmp4 Avol={Avol_val} GBW={GBW_val} Slew={Slew_val} Ilimit={Ilimit_val} Rail={Rail_val} Vos={Vos_val} Phimargin={Phimargin_val} En={En_val} Enk={Enk_val} In={In_val} Ink={Ink_val} Rin={Rin_val} Ro={Ro_val} Ccm={Ccm_val} Cdiff={Cdiff_val} (symbol OpAmps\UniversalOpAmp4 not available, pins judged from their places): In+=in19 In-=N133 V+=VDD V-=VSS OUT=N114
* U74: UniversalOpAmp4 Avol={Avol_val} GBW={GBW_val} Slew={Slew_val} Ilimit={Ilimit_val} Rail={Rail_val} Vos={Vos_val} Phimargin={Phimargin_val} En={En_val} Enk={Enk_val} In={In_val} Ink={Ink_val} Rin={Rin_val} Ro={Ro_val} Ccm={Ccm_val} Cdiff={Cdiff_val} (symbol OpAmps\UniversalOpAmp4 not available, pins judged from their places): In+=N147 In-=N133 V+=VDD V-=VSS OUT=N113
* U75: UniversalOpAmp4 Avol={Avol_val} GBW={GBW_val} Slew={Slew_val} Ilimit={Ilimit_val} Rail={Rail_val} Vos={Vos_val} Phimargin={Phimargin_val} En={En_val} Enk={Enk_val} In={In_val} Ink={Ink_val} Rin={Rin_val} Ro={Ro_val} Ccm={Ccm_val} Cdiff={Cdiff_val} (symbol OpAmps\UniversalOpAmp4 not available, pins judged from their places): In+=out19 In-=N134 V+=VDD V-=VSS OUT=N116
* U76: UniversalOpAmp4 Avol={Avol_val} GBW={GBW_val} Slew={Slew_val} Ilimit={Ilimit_val} Rail={Rail_val} Vos={Vos_val} Phimargin={Phimargin_val} En={En_val} Enk={Enk_val} In={In_val} Ink={Ink_val} Rin={Rin_val} Ro={Ro_val} Ccm={Ccm_val} Cdiff={Cdiff_val} (symbol OpAmps\UniversalOpAmp4 not available, pins judged from their places): In+=N148 In-=N134 V+=VDD V-=VSS OUT=N115
C77 in20 N117 {GICC(C_val,77)}
R116 N117 N135 {GICR(R1_val,116)}
R117 N135 N118 {GICR(R2_val,117)}
R118 N118 N149 {GICR(R3_val,118)}
C78 N149 0 {GICC(C_val,78)}
C79 out20 N119 {GICC(C_val,79)}
R119 N119 N136 {GICR(R4_val,119)}
R120 N136 N120 {GICR(R5_val,120)}
R121 N120 N150 {GICR(R6_val,121)}
C80 N150 0 {GICC(C_val,80)}
Rn20 out20 in20 R=Rn(20,V(in20,out20))
* U77: UniversalOpAmp4 Avol={Avol_val} GBW={GBW_val} Slew={Slew_val} Ilimit={Ilimit_val} Rail={Rail_val} Vos={Vos_val} Phimargin={Phimargin_val} En={En_val} Enk={Enk_val} In={In_val} Ink={Ink_val} Rin={Rin_val} Ro={Ro_val} Ccm={Ccm_val} Cdiff={Cdiff_val} (symbol OpAmps\UniversalOpAmp4 not available, pins judged from their places): In+=in20 In-=N135 V+=VDD V-=VSS OUT=N118
* U78: UniversalOpAmp4 Avol={Avol_val} GBW={GBW_val} Slew={Slew_val} Ilimit={Ilimit_val} Rail={Rail_val} Vos={Vos_val} Phimargin={Phimargin_val} En={En_val} Enk={Enk_val} In={In_val} Ink={Ink_val} Rin={Rin_val} Ro={Ro_val} Ccm={Ccm_val} Cdiff={Cdiff_val} (symbol OpAmps\UniversalOpAmp4 not available, pins judged from their places): In+=N149 In-=N135 V+=VDD V-=VSS OUT=N117
* U79: UniversalOpAmp4 Avol={Avol_val} GBW={GBW_val} Slew={Slew_val} Ilimit={Ilimit_val} Rail={Rail_val} Vos={Vos_val} Phimargin={Phimargin_val} En={En_val} Enk={Enk_val} In={In_val} Ink={Ink_val} Rin={Rin_val} Ro={Ro_val} Ccm={Ccm_val} Cdiff={Cdiff_val} (symbol OpAmps\UniversalOpAmp4 not available, pins judged from their places): In+=out20 In-=N136 V+=VDD V-=VSS OUT=N120
* U80: UniversalOpAmp4 Avol={Avol_val} GBW={GBW_val} Slew={Slew_val} Ilimit={Ilimit_val} Rail={Rail_val} Vos={Vos_val} Phimargin={Phimargin_val} En={En_val} Enk={Enk_val} In={In_val} Ink={Ink_val} Rin={Rin_val} Ro={Ro_val} Ccm={Ccm_val} Cdiff={Cdiff_val} (symbol OpAmps\UniversalOpAmp4 not available, pins judged from their places): In+=N150 In-=N136 V+=VDD V-=VSS OUT=N119
C81 in21 N121 {GICC(C_val,81)}
R122 N121 N137 {GICR(R1_val,122)}
R123 N137 N122 {GICR(R2_val,123)}
R124 N122 N151 {GICR(R3_val,124)}
C82 N151 0 {GICC(C_val,82)}
C83 out21 N123 {GICC(C_val,83)}
R125 N123 N138 {GICR(R4_val,125)}
R126 N138 N124 {GICR(R5_val,126)}
R127 N124 N152 {GICR(R6_val,127)}
C84 N152 0 {GICC(C_val,84)}
Rn21 out21 in21 R=Rn(21,V(in21,out21))
* U81: UniversalOpAmp4 Avol={Avol_val} GBW={GBW_val} Slew={Slew_val} Ilimit={Ilimit_val} Rail={Rail_val} Vos={Vos_val} Phimargin={Phimargin_val} En={En_val} Enk={Enk_val} In={In_val} Ink={Ink_val} Rin={Rin_val} Ro={Ro_val} Ccm={Ccm_val} Cdiff={Cdiff_val} (symbol OpAmps\UniversalOpAmp4 not available, pins judged from their places): In+=in21 In-=N137 V+=VDD V-=VSS OUT=N122
* U82: UniversalOpAmp4 Avol={Avol_val} GBW={GBW_val} Slew={Slew_val} Ilimit={Ilimit_val} Rail={Rail_val} Vos={Vos_val} Phimargin={Phimargin_val} En={En_val} Enk={Enk_val} In={In_val} Ink={Ink_val} Rin={Rin_val} Ro={Ro_val} Ccm={Ccm_val} Cdiff={Cdiff_val} (symbol OpAmps\UniversalOpAmp4 not available, pins judged from their places): In+=N151 In-=N137 V+=VDD V-=VSS OUT=N121
* U83: UniversalOpAmp4 Avol={Avol_val} GBW={GBW_val} Slew={Slew_val} Ilimit={Ilimit_val} Rail={Rail_val} Vos={Vos_val} Phimargin={Phimargin_val} En={En_val} Enk={Enk_val} In={In_val} Ink={Ink_val} Rin={Rin_val} Ro={Ro_val} Ccm={Ccm_val} Cdiff={Cdiff_val} (symbol OpAmps\UniversalOpAmp4 not available, pins judged from their places): In+=out21 In-=N138 V+=VDD V-=VSS OUT=N124
* U84: UniversalOpAmp4 Avol={Avol_val} GBW={GBW_val} Slew={Slew_val} Ilimit={Ilimit_val} Rail={Rail_val} Vos={Vos_val} Phimargin={Phimargin_val} En={En_val} Enk={Enk_val} In={In_val} Ink={Ink_val} Rin={Rin_val} Ro={Ro_val} Ccm={Ccm_val} Cdiff={Cdiff_val} (symbol OpAmps\UniversalOpAmp4 not available, pins judged from their places): In+=N152 In-=N138 V+=VDD V-=VSS OUT=N123
C85 in22 N153 {GICC(C_val,85)}
R128 N153 N181 {GICR(R1_val,128)}
R129 N181 N154 {GICR(R2_val,129)}
R130 N154 N195 {GICR(R3_val,130)}
C86 N195 0 {GICC(C_val,86)}
C87 out22 N155 {GICC(C_val,87)}
R131 N155 N182 {GICR(R4_val,131)}
R132 N182 N156 {GICR(R5_val,132)}
R133 N156 N196 {GICR(R6_val,133)}
C88 N196 0 {GICC(C_val,88)}
Rn22 out22 in22 R=Rn(22,V(in22,out22))
* U85: UniversalOpAmp4 Avol={Avol_val} GBW={GBW_val} Slew={Slew_val} Ilimit={Ilimit_val} Rail={Rail_val} Vos={Vos_val} Phimargin={Phimargin_val} En={En_val} Enk={Enk_val} In={In_val} Ink={Ink_val} Rin={Rin_val} Ro={Ro_val} Ccm={Ccm_val} Cdiff={Cdiff_val} (symbol OpAmps\UniversalOpAmp4 not available, pins judged from their places): In+=in22 In-=N181 V+=VDD V-=VSS OUT=N154
* U86: UniversalOpAmp4 Avol={Avol_val} GBW={GBW_val} Slew={Slew_val} Ilimit={Ilimit_val} Rail={Rail_val} Vos={Vos_val} Phimargin={Phimargin_val} En={En_val} Enk={Enk_val} In={In_val} Ink={Ink_val} Rin={Rin_val} Ro={Ro_val} Ccm={Ccm_val} Cdiff={Cdiff_val} (symbol OpAmps\UniversalOpAmp4 not available, pins judged from their places): In+=N195 In-=N181 V+=VDD V-=VSS OUT=N153
* U87: UniversalOpAmp4 Avol={Avol_val} GBW={GBW_val} Slew={Slew_val} Ilimit={Ilimit_val} Rail={Rail_val} Vos={Vos_val} Phimargin={Phimargin_val} En={En_val} Enk={Enk_val} In={In_val} Ink={Ink_val} Rin={Rin_val} Ro={Ro_val} Ccm={Ccm_val} Cdiff={Cdiff_val} (symbol OpAmps\UniversalOpAmp4 not available, pins judged from their places): In+=out22 In-=N182 V+=VDD V-=VSS OUT=N156
* U88: UniversalOpAmp4 Avol={Avol_val} GBW={GBW_val} Slew={Slew_val} Ilimit={Ilimit_val} Rail={Rail_val} Vos={Vos_val} Phimargin={Phimargin_val} En={En_val} Enk={Enk_val} In={In_val} Ink={Ink_val} Rin={Rin_val} Ro={Ro_val} Ccm={Ccm_val} Cdiff={Cdiff_val} (symbol OpAmps\UniversalOpAmp4 not available, pins judged from their places): In+=N196 In-=N182 V+=VDD V-=VSS OUT=N155
C89 in23 N157 {GICC(C_val,89)}
R134 N157 N183 {GICR(R1_val,134)}
R135 N183 N158 {GICR(R2_val,135)}
R136 N158 N197 {GICR(R3_val,136)}
C90 N197 0 {GICC(C_val,90)}
C91 out23 N159 {GICC(C_val,91)}
R137 N159 N184 {GICR(R4_val,137)}
R138 N184 N160 {GICR(R5_val,138)}
R139 N160 N198 {GICR(R6_val,139)}
C92 N198 0 {GICC(C_val,92)}
Rn23 out23 in23 R=Rn(23,V(in23,out23))
* U89: UniversalOpAmp4 Avol={Avol_val} GBW={GBW_val} Slew={Slew_val} Ilimit={Ilimit_val} Rail={Rail_val} Vos={Vos_val} Phimargin={Phimargin_val} En={En_val} Enk={Enk_val} In={In_val} Ink={Ink_val} Rin={Rin_val} Ro={Ro_val} Ccm={Ccm_val} Cdiff={Cdiff_val} (symbol OpAmps\UniversalOpAmp4 not available, pins judged from their places): In+=in23 In-=N183 V+=VDD V-=VSS OUT=N158
* U90: UniversalOpAmp4 Avol={Avol_val} GBW={GBW_val} Slew={Slew_val} Ilimit={Ilimit_val} Rail={Rail_val} Vos={Vos_val} Phimargin={Phimargin_val} En={En_val} Enk={Enk_val} In={In_val} Ink={Ink_val} Rin={Rin_val} Ro={Ro_val} Ccm={Ccm_val} Cdiff={Cdiff_val} (symbol OpAmps\UniversalOpAmp4 not available, pins judged from their places): In+=N197 In-=N183 V+=VDD V-=VSS OUT=N157
* U91: UniversalOpAmp4 Avol={Avol_val} GBW={GBW_val} Slew={Slew_val} Ilimit={Ilimit_val} Rail={Rail_val} Vos={Vos_val} Phimargin={Phimargin_val} En={En_val} Enk={Enk_val} In={In_val} Ink={Ink_val} Rin={Rin_val} Ro={Ro_val} Ccm={Ccm_val} Cdiff={Cdiff_val} (symbol OpAmps\UniversalOpAmp4 not available, pins judged from their places): In+=out23 In-=N184 V+=VDD V-=VSS OUT=N160
* U92: UniversalOpAmp4 Avol={Avol_val} GBW={GBW_val} Slew={Slew_val} Ilimit={Ilimit_val} Rail={Rail_val} Vos={Vos_val} Phimargin={Phimargin_val} En={En_val} Enk={Enk_val} In={In_val} Ink={Ink_val} Rin={Rin_val} Ro={Ro_val} Ccm={Ccm_val} Cdiff={Cdiff_val} (symbol OpAmps\UniversalOpAmp4 not available, pins judged from their places): In+=N198 In-=N184 V+=VDD V-=VSS OUT=N159
C93 in24 N161 {GICC(C_val,93)}
R140 N161 N185 {GICR(R1_val,140)}
R141 N185 N162 {GICR(R2_val,141)}
R142 N162 N199 {GICR(R3_val,142)}
C94 N199 0 {GICC(C_val,94)}
C95 out24 N163 {GICC(C_val,95)}
R143 N163 N186 {GICR(R4_val,143)}
R144 N186 N164 {GICR(R5_val,144)}
R145 N164 N200 {GICR(R6_val,145)}
C96 N200 0 {GICC(C_val,96)}
Rn24 out24 in24 R=Rn(24,V(in24,out24))
* U93: UniversalOpAmp4 Avol={Avol_val} GBW={GBW_val} Slew={Slew_val} Ilimit={Ilimit_val} Rail={Rail_val} Vos={Vos_val} Phimargin={Phimargin_val} En={En_val} Enk={Enk_val} In={In_val} Ink={Ink_val} Rin={Rin_val} Ro={Ro_val} Ccm={Ccm_val} Cdiff={Cdiff_val} (symbol OpAmps\UniversalOpAmp4 not available, pins judged from their places): In+=in24 In-=N185 V+=VDD V-=VSS OUT=N162
* U94: UniversalOpAmp4 Avol={Avol_val} GBW={GBW_val} Slew={Slew_val} Ilimit={Ilimit_val} Rail={Rail_val} Vos={Vos_val} Phimargin={Phimargin_val} En={En_val} Enk={Enk_val} In={In_val} Ink={Ink_val} Rin={Rin_val} Ro={Ro_val} Ccm={Ccm_val} Cdiff={Cdiff_val} (symbol OpAmps\UniversalOpAmp4 not available, pins judged from their places): In+=N199 In-=N185 V+=VDD V-=VSS OUT=N161
* U95: UniversalOpAmp4 Avol={Avol_val} GBW={GBW_val} Slew={Slew_val} Ilimit={Ilimit_val} Rail={Rail_val} Vos={Vos_val} Phimargin={Phimargin_val} En={En_val} Enk={Enk_val} In={In_val} Ink={Ink_val} Rin={Rin_val} Ro={Ro_val} Ccm={Ccm_val} Cdiff={Cdiff_val} (symbol OpAmps\UniversalOpAmp4 not available, pins judged from their places): In+=out24 In-=N186 V+=VDD V-=VSS OUT=N164
* U96: UniversalOpAmp4 Avol={Avol_val} GBW={GBW_val} Slew={Slew_val} Ilimit={Ilimit_val} Rail={Rail_val} Vos={Vos_val} Phimargin={Phimargin_val} En={En_val} Enk={Enk_val} In={In_val} Ink={Ink_val} Rin={Rin_val} Ro={Ro_val} Ccm={Ccm_val} Cdiff={Cdiff_val} (symbol OpAmps\UniversalOpAmp4 not available, pins judged from their places): In+=N200 In-=N186 V+=VDD V-=VSS OUT=N163
C97 in25 N165 {GICC(C_val,97)}
R146 N165 N187 {GICR(R1_val,146)}
R147 N187 N166 {GICR(R2_val,147)}
R148 N166 N201 {GICR(R3_val,148)}
C98 N201 0 {GICC(C_val,98)}
C99 out25 N167 {GICC(C_val,99)}
R149 N167 N188 {GICR(R4_val,149)}
R150 N188 N168 {GICR(R5_val,150)}
R151 N168 N202 {GICR(R6_val,151)}
C100 N202 0 {GICC(C_val,100)}
Rn25 out25 in25 R=Rn(25,V(in25,out25))
* U97: UniversalOpAmp4 Avol={Avol_val} GBW={GBW_val} Slew={Slew_val} Ilimit={Ilimit_val} Rail={Rail_val} Vos={Vos_val} Phimargin={Phimargin_val} En={En_val} Enk={Enk_val} In={In_val} Ink={Ink_val} Rin={Rin_val} Ro={Ro_val} Ccm={Ccm_val} Cdiff={Cdiff_val} (symbol OpAmps\UniversalOpAmp4 not available, pins judged from their places): In+=in25 In-=N187 V+=VDD V-=VSS OUT=N166
* U98: UniversalOpAmp4 Avol={Avol_val} GBW={GBW_val} Slew={Slew_val} Ilimit={Ilimit_val} Rail={Rail_val} Vos={Vos_val} Phimargin={Phimargin_val} En={En_val} Enk={Enk_val} In={In_val} Ink={Ink_val} Rin={Rin_val} Ro={Ro_val} Ccm={Ccm_val} Cdiff={Cdiff_val} (symbol OpAmps\UniversalOpAmp4 not available, pins judged from their places): In+=N201 In-=N187 V+=VDD V-=VSS OUT=N165
* U99: UniversalOpAmp4 Avol={Avol_val} GBW={GBW_val} Slew={Slew_val} Ilimit={Ilimit_val} Rail={Rail_val} Vos={Vos_val} Phimargin={Phimargin_val} En={En_val} Enk={Enk_val} In={In_val} Ink={Ink_val} Rin={Rin_val} Ro={Ro_val} Ccm={Ccm_val} Cdiff={Cdiff_val} (symbol OpAmps\UniversalOpAmp4 not available, pins judged from their places): In+=out25 In-=N188 V+=VDD V-=VSS OUT=N168
* U100: UniversalOpAmp4 Avol={Avol_val} GBW={GBW_val} Slew={Slew_val} Ilimit={Ilimit_val} Rail={Rail_val} Vos={Vos_val} Phimargin={Phimargin_val} En={En_val} Enk={Enk_val} In={In_val} Ink={Ink_val} Rin={Rin_val} Ro={Ro_val} Ccm={Ccm_val} Cdiff={Cdiff_val} (symbol OpAmps\UniversalOpAmp4 not available, pins judged from their places): In+=N202 In-=N188 V+=VDD V-=VSS OUT=N167
C101 in26 N169 {GICC(C_val,101)}
R152 N169 N189 {GICR(R1_val,152)}
R153 N189 N170 {GICR(R2_val,153)}
R154 N170 N203 {GICR(R3_val,154)}
C102 N203 0 {GICC(C_val,102)}
C103 out26 N171 {GICC(C_val,103)}
R155 N171 N190 {GICR(R4_val,155)}
R156 N190 N172 {GICR(R5_val,156)}
R157 N172 N204 {GICR(R6_val,157)}
C104 N204 0 {GICC(C_val,104)}
Rn26 out26 in26 R=Rn(26,V(in26,out26))
* U101: UniversalOpAmp4 Avol={Avol_val} GBW={GBW_val} Slew={Slew_val} Ilimit={Ilimit_val} Rail={Rail_val} Vos={Vos_val} Phimargin={Phimargin_val} En={En_val} Enk={Enk_val} In={In_val} Ink={Ink_val} Rin={Rin_val} Ro={Ro_val} Ccm={Ccm_val} Cdiff={Cdiff_val} (symbol OpAmps\UniversalOpAmp4 not available, pins judged from their places): In+=in26 In-=N189 V+=VDD V-=VSS OUT=N170
* U102: UniversalOpAmp4 Avol={Avol_val} GBW={GBW_val} Slew={Slew_val} Ilimit={Ilimit_val} Rail={Rail_val} Vos={Vos_val} Phimargin={Phimargin_val} En={En_val} Enk={Enk_val} In={In_val} Ink={Ink_val} Rin={Rin_val} Ro={Ro_val} Ccm={Ccm_val} Cdiff={Cdiff_val} (symbol OpAmps\UniversalOpAmp4 not available, pins judged from their places): In+=N203 In-=N189 V+=VDD V-=VSS OUT=N169
* U103: UniversalOpAmp4 Avol={Avol_val} GBW={GBW_val} Slew={Slew_val} Ilimit={Ilimit_val} Rail={Rail_val} Vos={Vos_val} Phimargin={Phimargin_val} En={En_val} Enk={Enk_val} In={In_val} Ink={Ink_val} Rin={Rin_val} Ro={Ro_val} Ccm={Ccm_val} Cdiff={Cdiff_val} (symbol OpAmps\UniversalOpAmp4 not available, pins judged from their places): In+=out26 In-=N190 V+=VDD V-=VSS OUT=N172
* U104: UniversalOpAmp4 Avol={Avol_val} GBW={GBW_val} Slew={Slew_val} Ilimit={Ilimit_val} Rail={Rail_val} Vos={Vos_val} Phimargin={Phimargin_val} En={En_val} Enk={Enk_val} In={In_val} Ink={Ink_val} Rin={Rin_val} Ro={Ro_val} Ccm={Ccm_val} Cdiff={Cdiff_val} (symbol OpAmps\UniversalOpAmp4 not available, pins judged from their places): In+=N204 In-=N190 V+=VDD V-=VSS OUT=N171
C105 in27 N173 {GICC(C_val,105)}
R158 N173 N191 {GICR(R1_val,158)}
R159 N191 N174 {GICR(R2_val,159)}
R160 N174 N205 {GICR(R3_val,160)}
C106 N205 0 {GICC(C_val,106)}
C107 out27 N175 {GICC(C_val,107)}
R161 N175 N192 {GICR(R4_val,161)}
R162 N192 N176 {GICR(R5_val,162)}
R163 N176 N206 {GICR(R6_val,163)}
C108 N206 0 {GICC(C_val,108)}
Rn27 out27 in27 R=Rn(27,V(in27,out27))
* U105: UniversalOpAmp4 Avol={Avol_val} GBW={GBW_val} Slew={Slew_val} Ilimit={Ilimit_val} Rail={Rail_val} Vos={Vos_val} Phimargin={Phimargin_val} En={En_val} Enk={Enk_val} In={In_val} Ink={Ink_val} Rin={Rin_val} Ro={Ro_val} Ccm={Ccm_val} Cdiff={Cdiff_val} (symbol OpAmps\UniversalOpAmp4 not available, pins judged from their places): In+=in27 In-=N191 V+=VDD V-=VSS OUT=N174
* U106: UniversalOpAmp4 Avol={Avol_val} GBW={GBW_val} Slew={Slew_val} Ilimit={Ilimit_val} Rail={Rail_val} Vos={Vos_val} Phimargin={Phimargin_val} En={En_val} Enk={Enk_val} In={In_val} Ink={Ink_val} Rin={Rin_val} Ro={Ro_val} Ccm={Ccm_val} Cdiff={Cdiff_val} (symbol OpAmps\UniversalOpAmp4 not available, pins judged from their places): In+=N205 In-=N191 V+=VDD V-=VSS OUT=N173